# Altium project RTL8316_8208_stand.PrjPcb
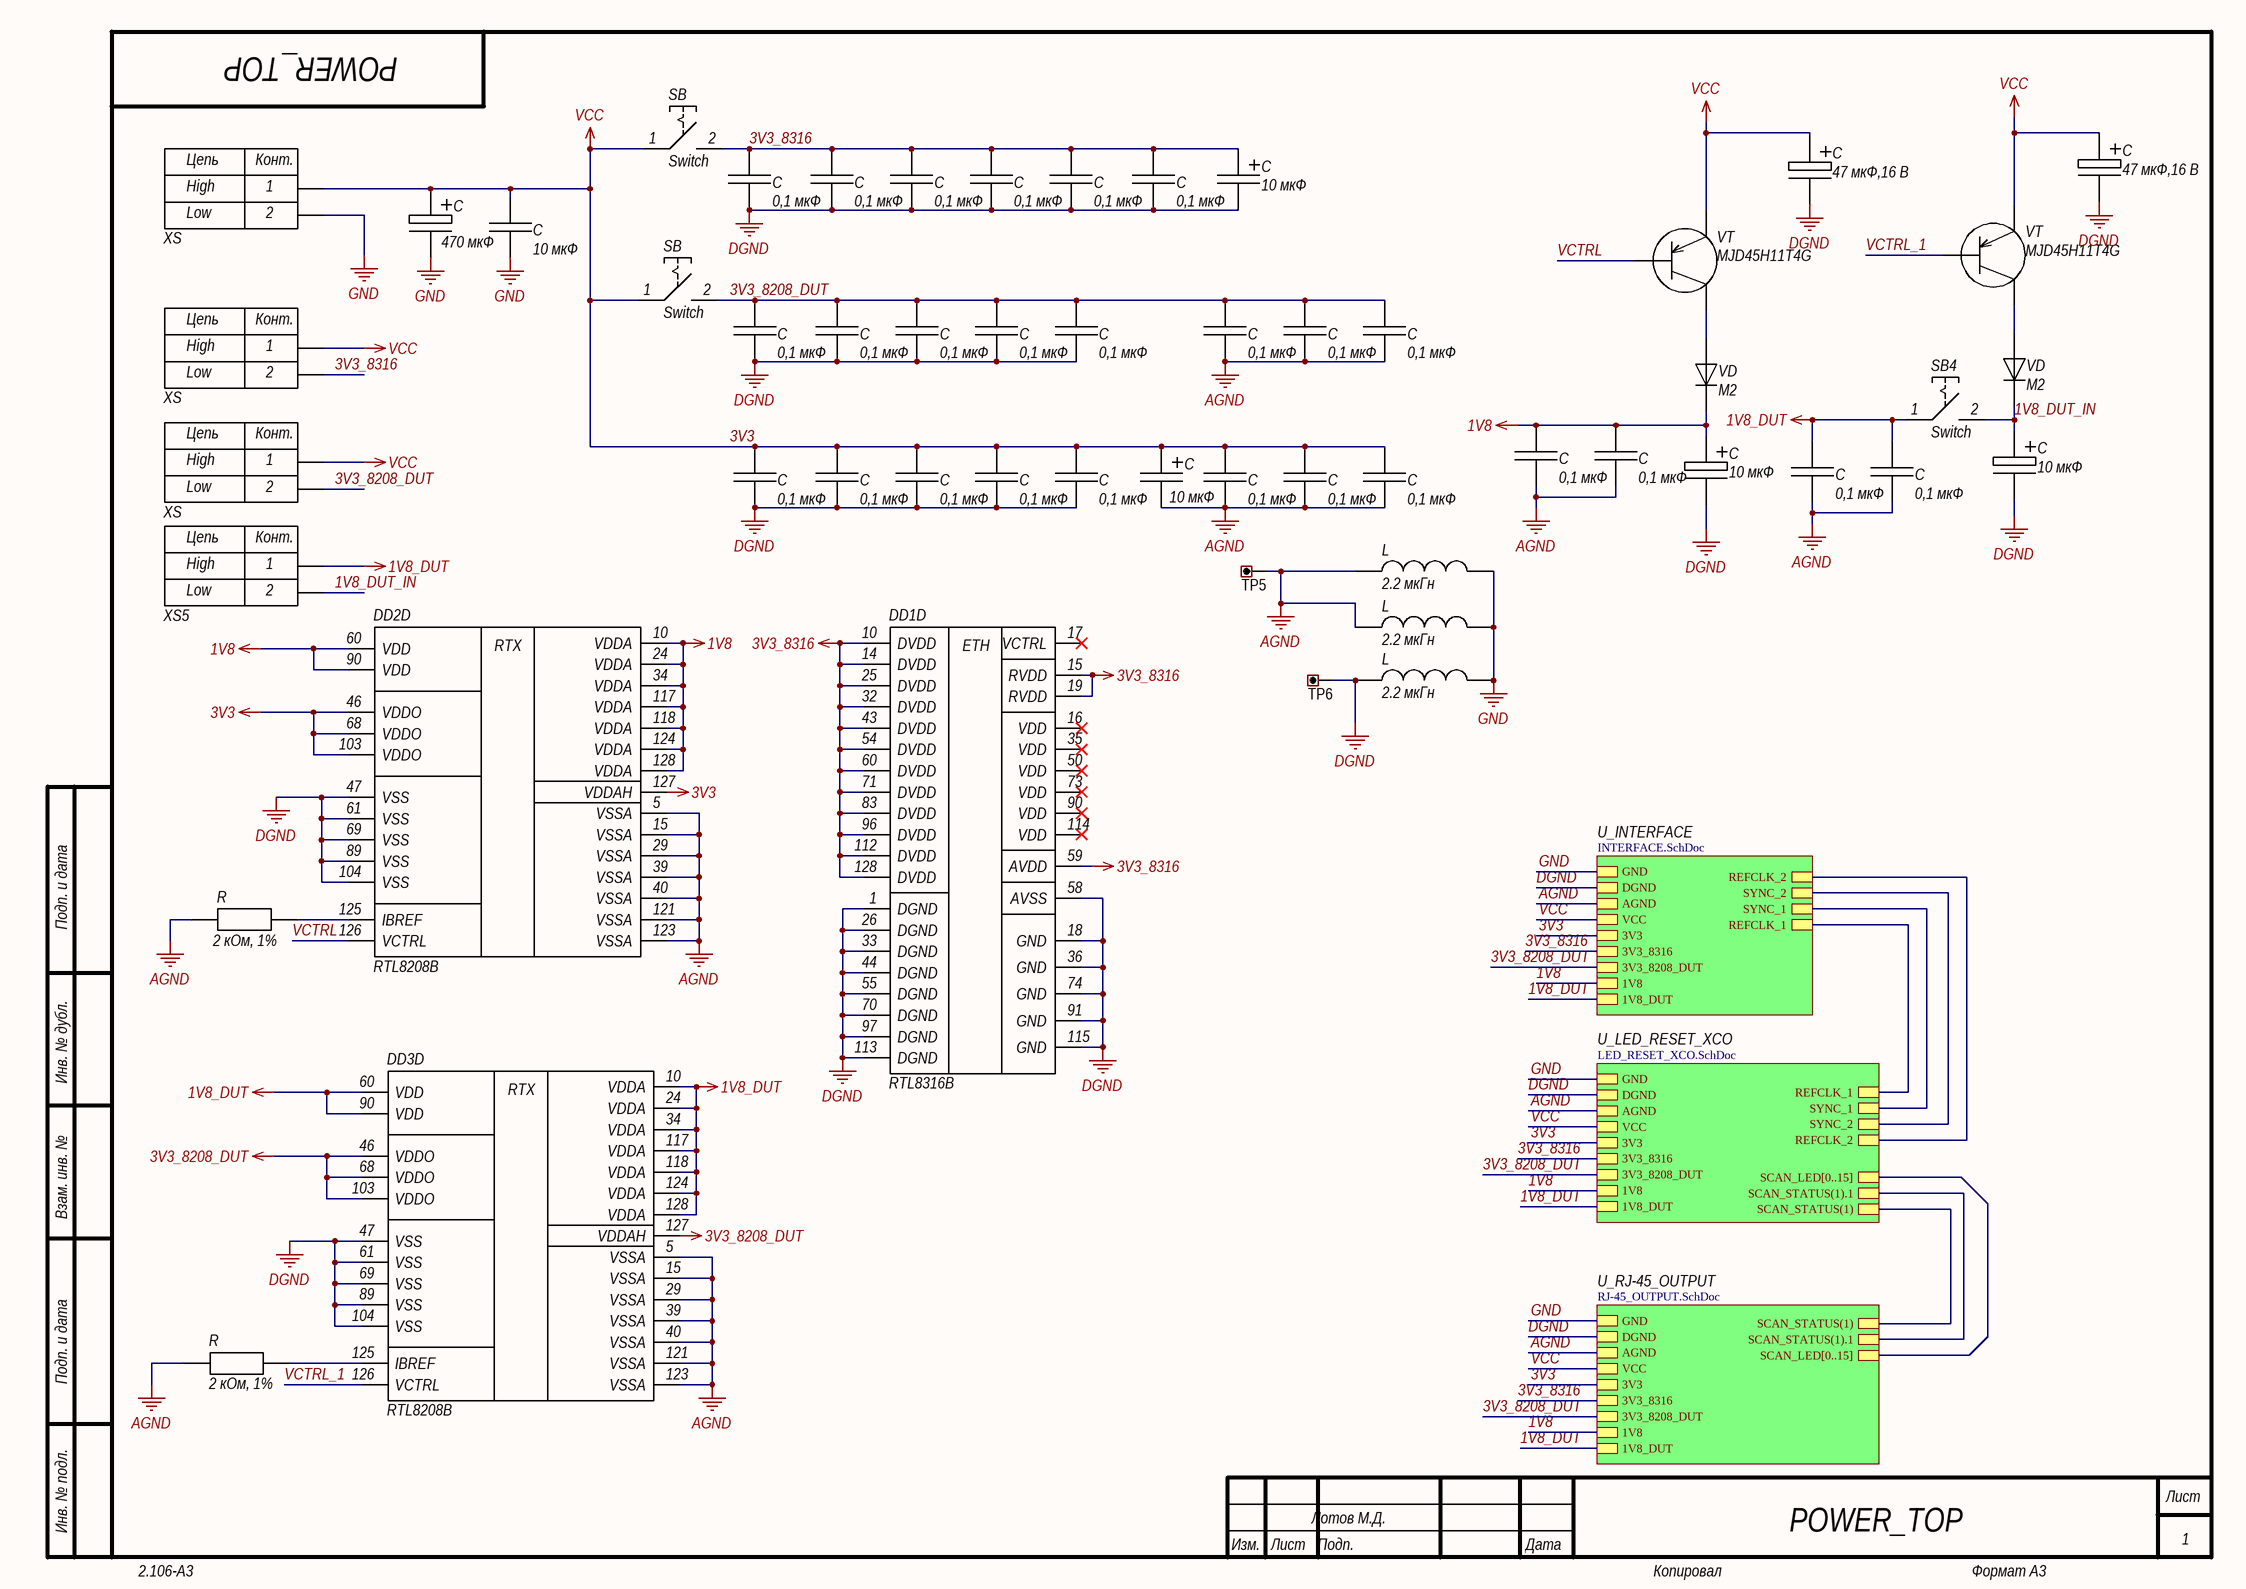
[diagram p0: POWER_TOP.SchDoc]
5 sheets, 305 parts. Net scope: hierarchical (ports join the sheet entries above them; power ports are global).
Board file: RTL8316_STAND.PcbDoc
Sheets:
  POWER_TOP.SchDoc
    U_INTERFACE = INTERFACE.SchDoc
    U_LED_RESET_XCO = LED_RESET_XCO.SchDoc
    U_RJ-45_OUTPUT = RJ-45_OUTPUT.SchDoc
      RJ45_1 = RJ-45_CONN.SchDoc
      RJ45_2 = RJ-45_CONN.SchDoc
      RJ45_3 = RJ-45_CONN.SchDoc
      RJ45_4 = RJ-45_CONN.SchDoc
      RJ45_9 = RJ-45_CONN.SchDoc
      RJ45_10 = RJ-45_CONN.SchDoc
      RJ45_11 = RJ-45_CONN.SchDoc
      RJ45_12 = RJ-45_CONN.SchDoc
      RJ45_5 = RJ-45_CONN.SchDoc
      RJ45_6 = RJ-45_CONN.SchDoc
      RJ45_7 = RJ-45_CONN.SchDoc
      RJ45_8 = RJ-45_CONN.SchDoc
      RJ45_13 = RJ-45_CONN.SchDoc
      RJ45_14 = RJ-45_CONN.SchDoc
      RJ45_15 = RJ-45_CONN.SchDoc
      RJ45_16 = RJ-45_CONN.SchDoc

## Sheet POWER_TOP.SchDoc
size 420 x 297 mm; Author: Лотов М.Д.; Address1: Address1; Address2: Address2; Address3: Address3; Address4: Address4; DocumentNumber: POWER_TOP; SheetNumber: 1; SheetTotal: 5; Scale: 1:1; DocumentType: Схема электрическая принципиальная; FirstReferrence: АБВГ.123456.001

### Parts
(Parts that share a designator on the sheet are numbered #1, #2 ... from top to bottom, then left to right.)
C#1  47 мкФ,16 В  [C_alumin_D=6.3mm]
C#2  47 мкФ,16 В  [C_alumin_D=6.3mm]
C#3  0,1 мкФ  [C0603]
C#4  0,1 мкФ  [C0603]
C#5  0,1 мкФ  [C0603]
C#6  0,1 мкФ  [C0603]
C#7  0,1 мкФ  [C0603]
C#8  0,1 мкФ  [C0603]
C#9  10 мкФ  [TECAP_type C]
C#10  470 мкФ  [C_alumin_8x10mm]
C#11  10 мкФ  [C0805]
C#12  0,1 мкФ  [C0603]
C#13  0,1 мкФ  [C0603]
C#14  0,1 мкФ  [C0603]
C#15  0,1 мкФ  [C0603]
C#16  0,1 мкФ  [C0603]
C#17  0,1 мкФ  [C0603]
C#18  0,1 мкФ  [C0603]
C#19  0,1 мкФ  [C0603]
C#20  0,1 мкФ  [C0603]
C#21  0,1 мкФ  [C0603]
C#22  10 мкФ  [C_alumin_D=4mm]
C#23  10 мкФ  [C_alumin_D=4mm]
C#24  0,1 мкФ  [C0603]
C#25  0,1 мкФ  [C0603]
C#26  0,1 мкФ  [C0603]
C#27  0,1 мкФ  [C0603]
C#28  0,1 мкФ  [C0603]
C#29  10 мкФ  [TECAP_type C]
C#30  0,1 мкФ  [C0603]
C#31  0,1 мкФ  [C0603]
C#32  0,1 мкФ  [C0603]
C#33  0,1 мкФ  [C0603]
C#34  0,1 мкФ  [C0603]
DD1  RTL8316B  [QFP-128_(14x20mm)_0.5mm_ZIF]  (part D of 4)
DD2  RTL8208B  [QFP-128_14x20mm_0.5mm]  (part D of 4)
DD3  RTL8208B  [QFP-128_(14x20mm)_0.5mm_ZIF]  (part D of 4)
L#1  2.2 мкГн  [CD43_Inductor]
L#2  2.2 мкГн  [CD43_Inductor]
L#3  2.2 мкГн  [CD43_Inductor]
R#1  2 кОм, 1%  [R0603]
R#2  2 кОм, 1%  [R0603]
SB4  Switch  [Switch_rocker]
SB#1  Switch  [Switch_rocker]
SB#2  Switch  [Switch_rocker]
TP5  (no value)  [PLS-1]
TP6  (no value)  [PLS-1]
VD#1  M2  [DO-214AC]
VD#2  M2  [DO-214AC]
VT#1  MJD45H11T4G  [DPAK]
VT#2  MJD45H11T4G  [DPAK]
XS5  Banana  [Banana_Connect]  (value not drawn)
XS#1  Banana  [Banana_Connect]  (value not drawn)
XS#2  Banana  [Banana_Connect]  (value not drawn)
XS#3  Banana  [Banana_Connect]  (value not drawn)

### Sub-sheets
U_INTERFACE = INTERFACE.SchDoc: GND, DGND, AGND, VCC, 3V3, 3V3_8316, 3V3_8208_DUT, 1V8, 1V8_DUT, REFCLK_2, SYNC_2, SYNC_1, REFCLK_1
U_LED_RESET_XCO = LED_RESET_XCO.SchDoc: GND, DGND, AGND, VCC, 3V3, 3V3_8316, 3V3_8208_DUT, 1V8, 1V8_DUT, REFCLK_1, REFCLK_2, SYNC_1, SYNC_2, SCAN_LED[0..15], SCAN_STATUS(1).1, SCAN_STATUS(1)
U_RJ-45_OUTPUT = RJ-45_OUTPUT.SchDoc: GND, DGND, AGND, VCC, 3V3, 3V3_8316, 3V3_8208_DUT, 1V8, 1V8_DUT, SCAN_STATUS(1), SCAN_STATUS(1).1, SCAN_LED[0..15]

### Nets
1V8: C#20.1 C#21.1 C#23.1 DD2.10(VDDA) DD2.24(VDDA) DD2.34(VDDA) DD2.60(VDD) DD2.90(VDD) DD2.117(VDDA) DD2.118(VDDA) DD2.124(VDDA) DD2.128(VDDA) VD#1.1 ; sheet U_INTERFACE/1V8, sheet U_LED_RESET_XCO/1V8, sheet U_RJ-45_OUTPUT/1V8
1V8_DUT: C#33.1 C#34.1 DD3.10(VDDA) DD3.24(VDDA) DD3.34(VDDA) DD3.60(VDD) DD3.90(VDD) DD3.117(VDDA) DD3.118(VDDA) DD3.124(VDDA) DD3.128(VDDA) SB4.1 XS5.1 ; sheet U_INTERFACE/1V8_DUT, sheet U_LED_RESET_XCO/1V8_DUT, sheet U_RJ-45_OUTPUT/1V8_DUT
3V3: C#1.1 C#2.1 C#10.1 C#11.1 C#24.1 C#25.1 C#26.1 C#27.1 C#28.1 C#29.1 C#30.1 C#31.1 C#32.1 DD2.46(VDDO) DD2.68(VDDO) DD2.103(VDDO) DD2.127(VDDAH) SB#1.1 SB#2.1 VT#1.2 VT#2.2 XS#1.1 XS#2.1 XS#3.1 ; sheet U_INTERFACE/VCC, sheet U_INTERFACE/3V3, sheet U_LED_RESET_XCO/VCC, sheet U_LED_RESET_XCO/3V3, sheet U_RJ-45_OUTPUT/VCC, sheet U_RJ-45_OUTPUT/3V3  [also labelled VCC]
3V3_8208_DUT: C#12.1 C#13.1 C#14.1 C#15.1 C#16.1 C#17.1 C#18.1 C#19.1 DD3.46(VDDO) DD3.68(VDDO) DD3.103(VDDO) DD3.127(VDDAH) SB#2.2 XS#3.2 ; sheet U_INTERFACE/3V3_8208_DUT, sheet U_LED_RESET_XCO/3V3_8208_DUT, sheet U_RJ-45_OUTPUT/3V3_8208_DUT
3V3_8316: C#3.1 C#4.1 C#5.1 C#6.1 C#7.1 C#8.1 C#9.1 DD1.10(DVDD) DD1.14(DVDD) DD1.15(RVDD) DD1.19(RVDD) DD1.25(DVDD) DD1.32(DVDD) DD1.43(DVDD) DD1.54(DVDD) DD1.59(AVDD) DD1.60(DVDD) DD1.71(DVDD) DD1.83(DVDD) DD1.96(DVDD) DD1.112(DVDD) DD1.128(DVDD) SB#1.2 XS#2.2 ; sheet U_INTERFACE/3V3_8316, sheet U_LED_RESET_XCO/3V3_8316, sheet U_RJ-45_OUTPUT/3V3_8316
AGND: C#17.2 C#18.2 C#19.2 C#20.2 C#21.2 C#29.2 C#30.2 C#31.2 C#32.2 C#33.2 C#34.2 DD2.5(VSSA) DD2.15(VSSA) DD2.29(VSSA) DD2.39(VSSA) DD2.40(VSSA) DD2.121(VSSA) DD2.123(VSSA) DD3.5(VSSA) DD3.15(VSSA) DD3.29(VSSA) DD3.39(VSSA) DD3.40(VSSA) DD3.121(VSSA) DD3.123(VSSA) L#1.1(x) L#2.1(x) R#1.1(x) R#2.1(x) TP5.1 ; sheet U_INTERFACE/AGND, sheet U_LED_RESET_XCO/AGND, sheet U_RJ-45_OUTPUT/AGND
DGND: C#1.2 C#2.2 C#3.2 C#4.2 C#5.2 C#6.2 C#7.2 C#8.2 C#9.2 C#12.2 C#13.2 C#14.2 C#15.2 C#16.2 C#22.2 C#23.2 C#24.2 C#25.2 C#26.2 C#27.2 C#28.2 DD1.1(DGND) DD1.18(GND) DD1.26(DGND) DD1.33(DGND) DD1.36(GND) DD1.44(DGND) DD1.55(DGND) DD1.58(AVSS) DD1.70(DGND) DD1.74(GND) DD1.91(GND) DD1.97(DGND) DD1.113(DGND) DD1.115(GND) DD2.47(VSS) DD2.61(VSS) DD2.69(VSS) DD2.89(VSS) DD2.104(VSS) DD3.47(VSS) DD3.61(VSS) DD3.69(VSS) DD3.89(VSS) DD3.104(VSS) L#3.2 TP6.1 ; sheet U_INTERFACE/DGND, sheet U_LED_RESET_XCO/DGND, sheet U_RJ-45_OUTPUT/DGND
GND: C#10.2 C#11.2 L#1.2 L#2.2 L#3.1(x) XS#1.2 ; sheet U_INTERFACE/GND, sheet U_LED_RESET_XCO/GND, sheet U_RJ-45_OUTPUT/GND
1V8_DUT_IN: C#22.1 SB4.2 VD#2.1 XS5.2
REFCLK_1: sheet U_INTERFACE/REFCLK_1, sheet U_LED_RESET_XCO/REFCLK_1
REFCLK_2: sheet U_INTERFACE/REFCLK_2, sheet U_LED_RESET_XCO/REFCLK_2
SC_ST(1): sheet U_LED_RESET_XCO/SCAN_STATUS(1), sheet U_RJ-45_OUTPUT/SCAN_STATUS(1)
SC_ST(1).1: sheet U_LED_RESET_XCO/SCAN_STATUS(1).1, sheet U_RJ-45_OUTPUT/SCAN_STATUS(1).1
SYNC_1: sheet U_INTERFACE/SYNC_1, sheet U_LED_RESET_XCO/SYNC_1
SYNC_2: sheet U_INTERFACE/SYNC_2, sheet U_LED_RESET_XCO/SYNC_2
VCTRL: DD2.126(VCTRL) VT#2.1
VCTRL_1: DD3.126(VCTRL) VT#1.1
NetDD2_125: DD2.125(IBREF) R#1.2
NetDD3_125: DD3.125(IBREF) R#2.2
NetVD#1_2: VD#1.2 VT#2.3
NetVD#2_2: VD#2.2 VT#1.3

Not connected (* = marked no-connect by the designer): DD1 16(VDD)* 17(VCTRL)* 35(VDD)* 50(VDD)* 73(VDD)* 90(VDD)* 114(VDD)*

### Buses and harness runs
bus sheet U_LED_RESET_XCO/SCAN_LED[0..15] = sheet U_RJ-45_OUTPUT/SCAN_LED[0..15]

### Notes on the sheet
- Подп. и дата
- Инв. № дубл.
- Взам. инв. №
- Инв. № подл.
- Изм.
- Лист
- Подп.
- Дата
- 2.106-A3
- Копировал
- Формат А3
- (in symbol Banana) Цепь; Конт.; High; Low
- (in symbol RTL8208B, part D) RTX
- (in symbol RTL8316B, part D) ETH

### Library data of the parts
C#1 C#2 C#10 C#22 C#23 = Cap_Electrolyte
C#3-C#8 C#11-C#21 C#24-C#28 C#30-C#34 = Capacitance_SMD
C#9 C#29 = T_Cap_SMD
L#1-L#3 = Inductance_SMD
R#1 R#2 = Resistor_SMD
SB4 SB#1 SB#2 = Switch Rocker: ON-OFF SPST Switch
TP5 TP6 = Connector_Test_Point: Manufacturer: Keystone; ValueManufacturerPartNumber: Test point, Keystone, 5001; PartNumber: 5001; TypeConnector: Test point; HelpURL: https://www.digikey.com/product-detail/en/keystone-electronics/5001/36-5001-ND/255327
VD#1 VD#2 = Diode
VT#1 VT#2 = PNP
XS5 XS#1-XS#3 = Banana: Banana Connectors

## Sheet INTERFACE.SchDoc
size 420 x 297 mm; Author: Лотов М.Д,; Address1: Address1; Address2: Address2; Address3: Address3; Address4: Address4; DocumentNumber: INTERFACE; SheetNumber: 2; SheetTotal: 5; Scale: 1:1; DocumentType: Схема электрическая принципиальная; FirstReferrence: АБВГ.123456.001
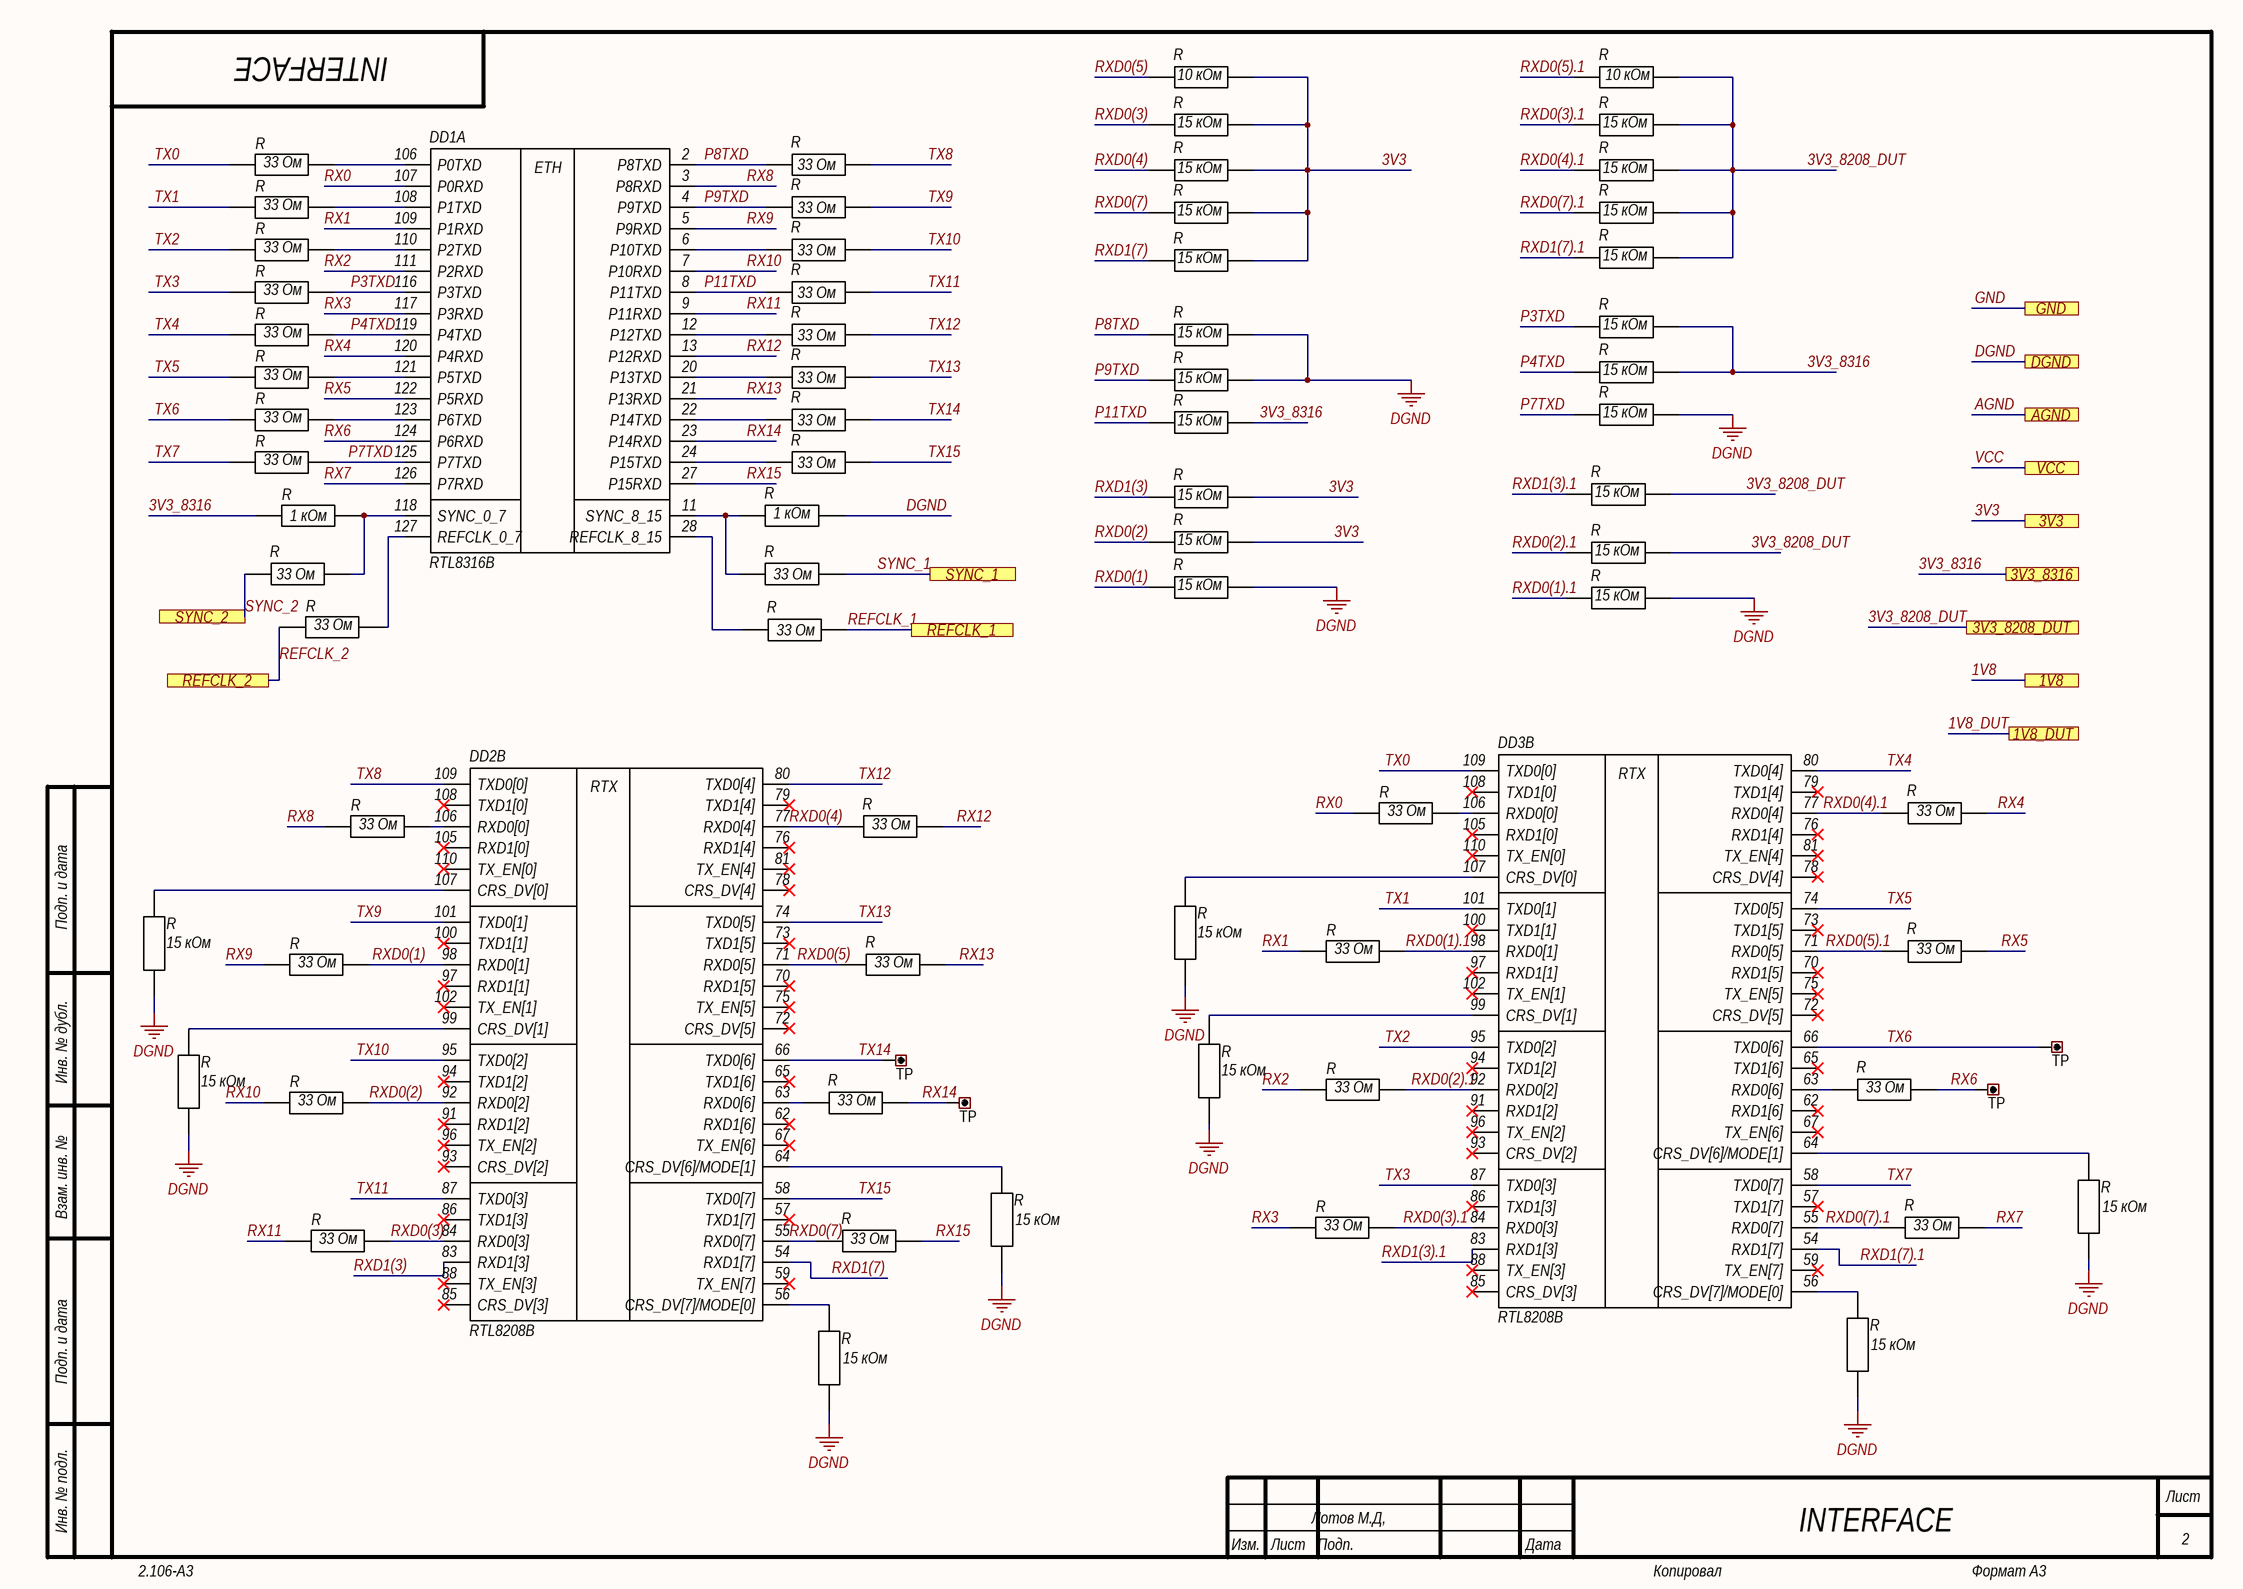
[diagram p1: INTERFACE.SchDoc]

### Parts
(Parts that share a designator on the sheet are numbered #1, #2 ... from top to bottom, then left to right.)
DD1  RTL8316B  [QFP-128_(14x20mm)_0.5mm_ZIF]  (part A of 4)
DD2  RTL8208B  [QFP-128_14x20mm_0.5mm]  (part B of 4)
DD3  RTL8208B  [QFP-128_(14x20mm)_0.5mm_ZIF]  (part B of 4)
R#3  10 кОм  [R0603]
R#4  10 кОм  [R0603]
R#5  15 кОм  [R0603]
R#6  15 кОм  [R0603]
R#7  33 Ом  [R0603]
R#8  33 Ом  [R0603]
R#9  15 кОм  [R0603]
R#10  15 кОм  [R0603]
R#11  33 Ом  [R0603]
R#12  33 Ом  [R0603]
R#13  15 кОм  [R0603]
R#14  15 кОм  [R0603]
R#15  33 Ом  [R0603]
R#16  33 Ом  [R0603]
R#17  15 кОм  [R0603]
R#18  15 кОм  [R0603]
R#19  33 Ом  [R0603]
R#20  33 Ом  [R0603]
R#21  15 кОм  [R0603]
R#22  33 Ом  [R0603]
R#23  33 Ом  [R0603]
R#24  15 кОм  [R0603]
R#25  15 кОм  [R0603]
R#26  33 Ом  [R0603]
R#27  33 Ом  [R0603]
R#28  15 кОм  [R0603]
R#29  15 кОм  [R0603]
R#30  33 Ом  [R0603]
R#31  33 Ом  [R0603]
R#32  15 кОм  [R0603]
R#33  33 Ом  [R0603]
R#34  33 Ом  [R0603]
R#35  15 кОм  [R0603]
R#36  15 кОм  [R0603]
R#37  1 кОм  [R0603]
R#38  1 кОм  [R0603]
R#39  15 кОм  [R0603]
R#40  15 кОм  [R0603]
R#41  33 Ом  [R0603]
R#42  33 Ом  [R0603]
R#43  15 кОм  [R0603]
R#44  15 кОм  [R0603]
R#45  33 Ом  [R0603]
R#46  33 Ом  [R0603]
R#47  33 Ом  [R0603]
R#48  33 Ом  [R0603]
R#49  33 Ом  [R0603]
R#50  33 Ом  [R0603]
R#51  33 Ом  [R0603]
R#52  33 Ом  [R0603]
R#53  33 Ом  [R0603]
R#54  33 Ом  [R0603]
R#55  15 кОм  [R0603]
R#56  15 кОм  [R0603]
R#57  33 Ом  [R0603]
R#58  33 Ом  [R0603]
R#59  33 Ом  [R0603]
R#60  33 Ом  [R0603]
R#61  15 кОм  [R0603]
R#62  15 кОм  [R0603]
R#63  33 Ом  [R0603]
R#64  33 Ом  [R0603]
R#65  33 Ом  [R0603]
R#66  33 Ом  [R0603]
R#67  15 кОм  [R0603]
R#68  15 кОм  [R0603]
R#69  15 кОм  [R0603]
R#70  15 кОм  [R0603]
TP#1  (no value)  [PLS2-1]
TP#2  (no value)  [PLS2-1]
TP#3  (no value)  [PLS2-1]
TP#4  (no value)  [PLS2-1]

### Ports
1V8, 1V8_DUT, 3V3, 3V3_8208_DUT, 3V3_8316, AGND, DGND, GND, REFCLK_1, REFCLK_2, SYNC_1, SYNC_2, VCC

### Nets
3V3: R#3.1(x) R#5.1(x) R#9.1(x) R#13.1(x) R#17.1(x) R#35.1(x) R#39.1(x) ; port VCC, port 3V3  [also labelled VCC]
3V3_8208_DUT: R#4.1(x) R#6.1(x) R#10.1(x) R#14.1(x) R#18.1(x) R#36.1(x) R#40.1(x) ; port 3V3_8208_DUT
3V3_8316: R#21.1(x) R#25.1(x) R#32.1(x) R#37.1(x) ; port 3V3_8316
DGND: R#24.1(x) R#28.1(x) R#29.1(x) R#38.1(x) R#43.1(x) R#44.1(x) R#55.1(x) R#56.1(x) R#61.1(x) R#62.1(x) R#67.1(x) R#68.1(x) R#69.1(x) R#70.1(x) ; port DGND
P3TXD: DD1.116(P3TXD) R#19.2 R#21.2
P4TXD: DD1.119(P4TXD) R#22.2 R#25.2
P7TXD: DD1.125(P7TXD) R#29.2 R#33.2
P8TXD: DD1.2(P8TXD) R#8.2 R#24.2
P9TXD: DD1.4(P9TXD) R#12.2 R#28.2
P11TXD: DD1.8(P11TXD) R#20.2 R#32.2
REFCLK_1: R#46.1(x) ; port REFCLK_1
REFCLK_2: R#45.1(x) ; port REFCLK_2
RX0: DD1.107(P0RXD) R#47.1(x)
RX1: DD1.109(P1RXD) R#51.1(x)
RX2: DD1.111(P2RXD) R#57.1(x)
RX3: DD1.117(P3RXD) R#63.1(x)
RX4: DD1.120(P4RXD) R#48.1(x)
RX5: DD1.122(P5RXD) R#52.1(x)
RX6: DD1.124(P6RXD) R#58.1(x) TP#3.1
RX7: DD1.126(P7RXD) R#64.1(x)
RX8: DD1.3(P8RXD) R#49.1(x)
RX9: DD1.5(P9RXD) R#53.1(x)
RX10: DD1.7(P10RXD) R#59.1(x)
RX11: DD1.9(P11RXD) R#65.1(x)
RX12: DD1.13(P12RXD) R#50.1(x)
RX13: DD1.21(P13RXD) R#54.1(x)
RX14: DD1.23(P14RXD) R#60.1(x) TP#4.1
RX15: DD1.27(P15RXD) R#66.1(x)
RXD0(1): DD2.98(RXD0[1]) R#43.2 R#53.2
RXD0(1).1: DD3.98(RXD0[1]) R#44.2 R#51.2
RXD0(2): DD2.92(RXD0[2]) R#39.2 R#59.2
RXD0(2).1: DD3.92(RXD0[2]) R#40.2 R#57.2
RXD0(3): DD2.84(RXD0[3]) R#5.2 R#65.2
RXD0(3).1: DD3.84(RXD0[3]) R#6.2 R#63.2
RXD0(4): DD2.77(RXD0[4]) R#9.2 R#50.2
RXD0(4).1: DD3.77(RXD0[4]) R#10.2 R#48.2
RXD0(5): DD2.71(RXD0[5]) R#3.2 R#54.2
RXD0(5).1: DD3.71(RXD0[5]) R#4.2 R#52.2
RXD0(7): DD2.55(RXD0[7]) R#13.2 R#66.2
RXD0(7).1: DD3.55(RXD0[7]) R#14.2 R#64.2
RXD1(3): DD2.83(RXD1[3]) R#35.2
RXD1(3).1: DD3.83(RXD1[3]) R#36.2
RXD1(7): DD2.54(RXD1[7]) R#17.2
RXD1(7).1: DD3.54(RXD1[7]) R#18.2
SYNC_1: R#42.1(x) ; port SYNC_1
SYNC_2: R#41.1(x) ; port SYNC_2
TX0: DD3.109(TXD0[0]) R#7.1(x)
TX1: DD3.101(TXD0[1]) R#11.1(x)
TX2: DD3.95(TXD0[2]) R#15.1(x)
TX3: DD3.87(TXD0[3]) R#19.1(x)
TX4: DD3.80(TXD0[4]) R#22.1(x)
TX5: DD3.74(TXD0[5]) R#26.1(x)
TX6: DD3.66(TXD0[6]) R#30.1(x) TP#1.1
TX7: DD3.58(TXD0[7]) R#33.1(x)
TX8: DD2.109(TXD0[0]) R#8.1(x)
TX9: DD2.101(TXD0[1]) R#12.1(x)
TX10: DD2.95(TXD0[2]) R#16.1(x)
TX11: DD2.87(TXD0[3]) R#20.1(x)
TX12: DD2.80(TXD0[4]) R#23.1(x)
TX13: DD2.74(TXD0[5]) R#27.1(x)
TX14: DD2.66(TXD0[6]) R#31.1(x) TP#2.1
TX15: DD2.58(TXD0[7]) R#34.1(x)
NetDD1_6: DD1.6(P10TXD) R#16.2
NetDD1_11: DD1.11(SYNC_8_15) R#38.2 R#42.2
NetDD1_12: DD1.12(P12TXD) R#23.2
NetDD1_20: DD1.20(P13TXD) R#27.2
NetDD1_22: DD1.22(P14TXD) R#31.2
NetDD1_24: DD1.24(P15TXD) R#34.2
NetDD1_28: DD1.28(REFCLK_8_15) R#46.2
NetDD1_106: DD1.106(P0TXD) R#7.2
NetDD1_108: DD1.108(P1TXD) R#11.2
NetDD1_110: DD1.110(P2TXD) R#15.2
NetDD1_118: DD1.118(SYNC_0_7) R#37.2 R#41.2
NetDD1_121: DD1.121(P5TXD) R#26.2
NetDD1_123: DD1.123(P6TXD) R#30.2
NetDD1_127: DD1.127(REFCLK_0_7) R#45.2
NetDD2_56: DD2.56(CRS_DV[7]/MODE[0]) R#70.2
NetDD2_63: DD2.63(RXD0[6]) R#60.2
NetDD2_64: DD2.64(CRS_DV[6]/MODE[1]) R#68.2
NetDD2_99: DD2.99(CRS_DV[1]) R#62.2
NetDD2_106: DD2.106(RXD0[0]) R#49.2
NetDD2_107: DD2.107(CRS_DV[0]) R#56.2
NetDD3_56: DD3.56(CRS_DV[7]/MODE[0]) R#69.2
NetDD3_63: DD3.63(RXD0[6]) R#58.2
NetDD3_64: DD3.64(CRS_DV[6]/MODE[1]) R#67.2
NetDD3_99: DD3.99(CRS_DV[1]) R#61.2
NetDD3_106: DD3.106(RXD0[0]) R#47.2
NetDD3_107: DD3.107(CRS_DV[0]) R#55.2

Not connected (* = marked no-connect by the designer): DD2 57(TXD1[7])* 59(TX_EN[7])* 62(RXD1[6])* 65(TXD1[6])* 67(TX_EN[6])* 70(RXD1[5])* 72(CRS_DV[5])* 73(TXD1[5])* 75(TX_EN[5])* 76(RXD1[4])* 78(CRS_DV[4])* 79(TXD1[4])* 81(TX_EN[4])* 85(CRS_DV[3])* 86(TXD1[3])* 88(TX_EN[3])* 91(RXD1[2])* 93(CRS_DV[2])* 94(TXD1[2])* 96(TX_EN[2])* 97(RXD1[1])* 100(TXD1[1])* 102(TX_EN[1])* 105(RXD1[0])* 108(TXD1[0])* 110(TX_EN[0])*; DD3 57(TXD1[7])* 59(TX_EN[7])* 62(RXD1[6])* 65(TXD1[6])* 67(TX_EN[6])* 70(RXD1[5])* 72(CRS_DV[5])* 73(TXD1[5])* 75(TX_EN[5])* 76(RXD1[4])* 78(CRS_DV[4])* 79(TXD1[4])* 81(TX_EN[4])* 85(CRS_DV[3])* 86(TXD1[3])* 88(TX_EN[3])* 91(RXD1[2])* 93(CRS_DV[2])* 94(TXD1[2])* 96(TX_EN[2])* 97(RXD1[1])* 100(TXD1[1])* 102(TX_EN[1])* 105(RXD1[0])* 108(TXD1[0])* 110(TX_EN[0])*

### Notes on the sheet
- Подп. и дата
- Инв. № дубл.
- Взам. инв. №
- Инв. № подл.
- Изм.
- Лист
- Подп.
- Дата
- 2.106-A3
- Копировал
- Формат А3
- (in symbol RTL8208B, part B) RTX
- (in symbol RTL8316B, part A) ETH

### Library data of the parts
R#3-R#70 = Resistor_SMD
TP#1-TP#4 = Connector_Test_Point: as TP5 on sheet POWER_TOP; HelpURL: https://www.digikey.com/product-detail/en/keystone-electronics/5001/36-5001-ND/255327

## Sheet LED_RESET_XCO.SchDoc
size 420 x 297 mm; Author: Лотов М.Д.; Address1: Address1; Address2: Address2; Address3: Address3; Address4: Address4; DocumentNumber: LED_RESET_XCO; SheetNumber: 5; SheetTotal: 5; Scale: 1:1; DocumentType: Схема электрическая принципиальная; FirstReferrence: АБВГ.123456.001
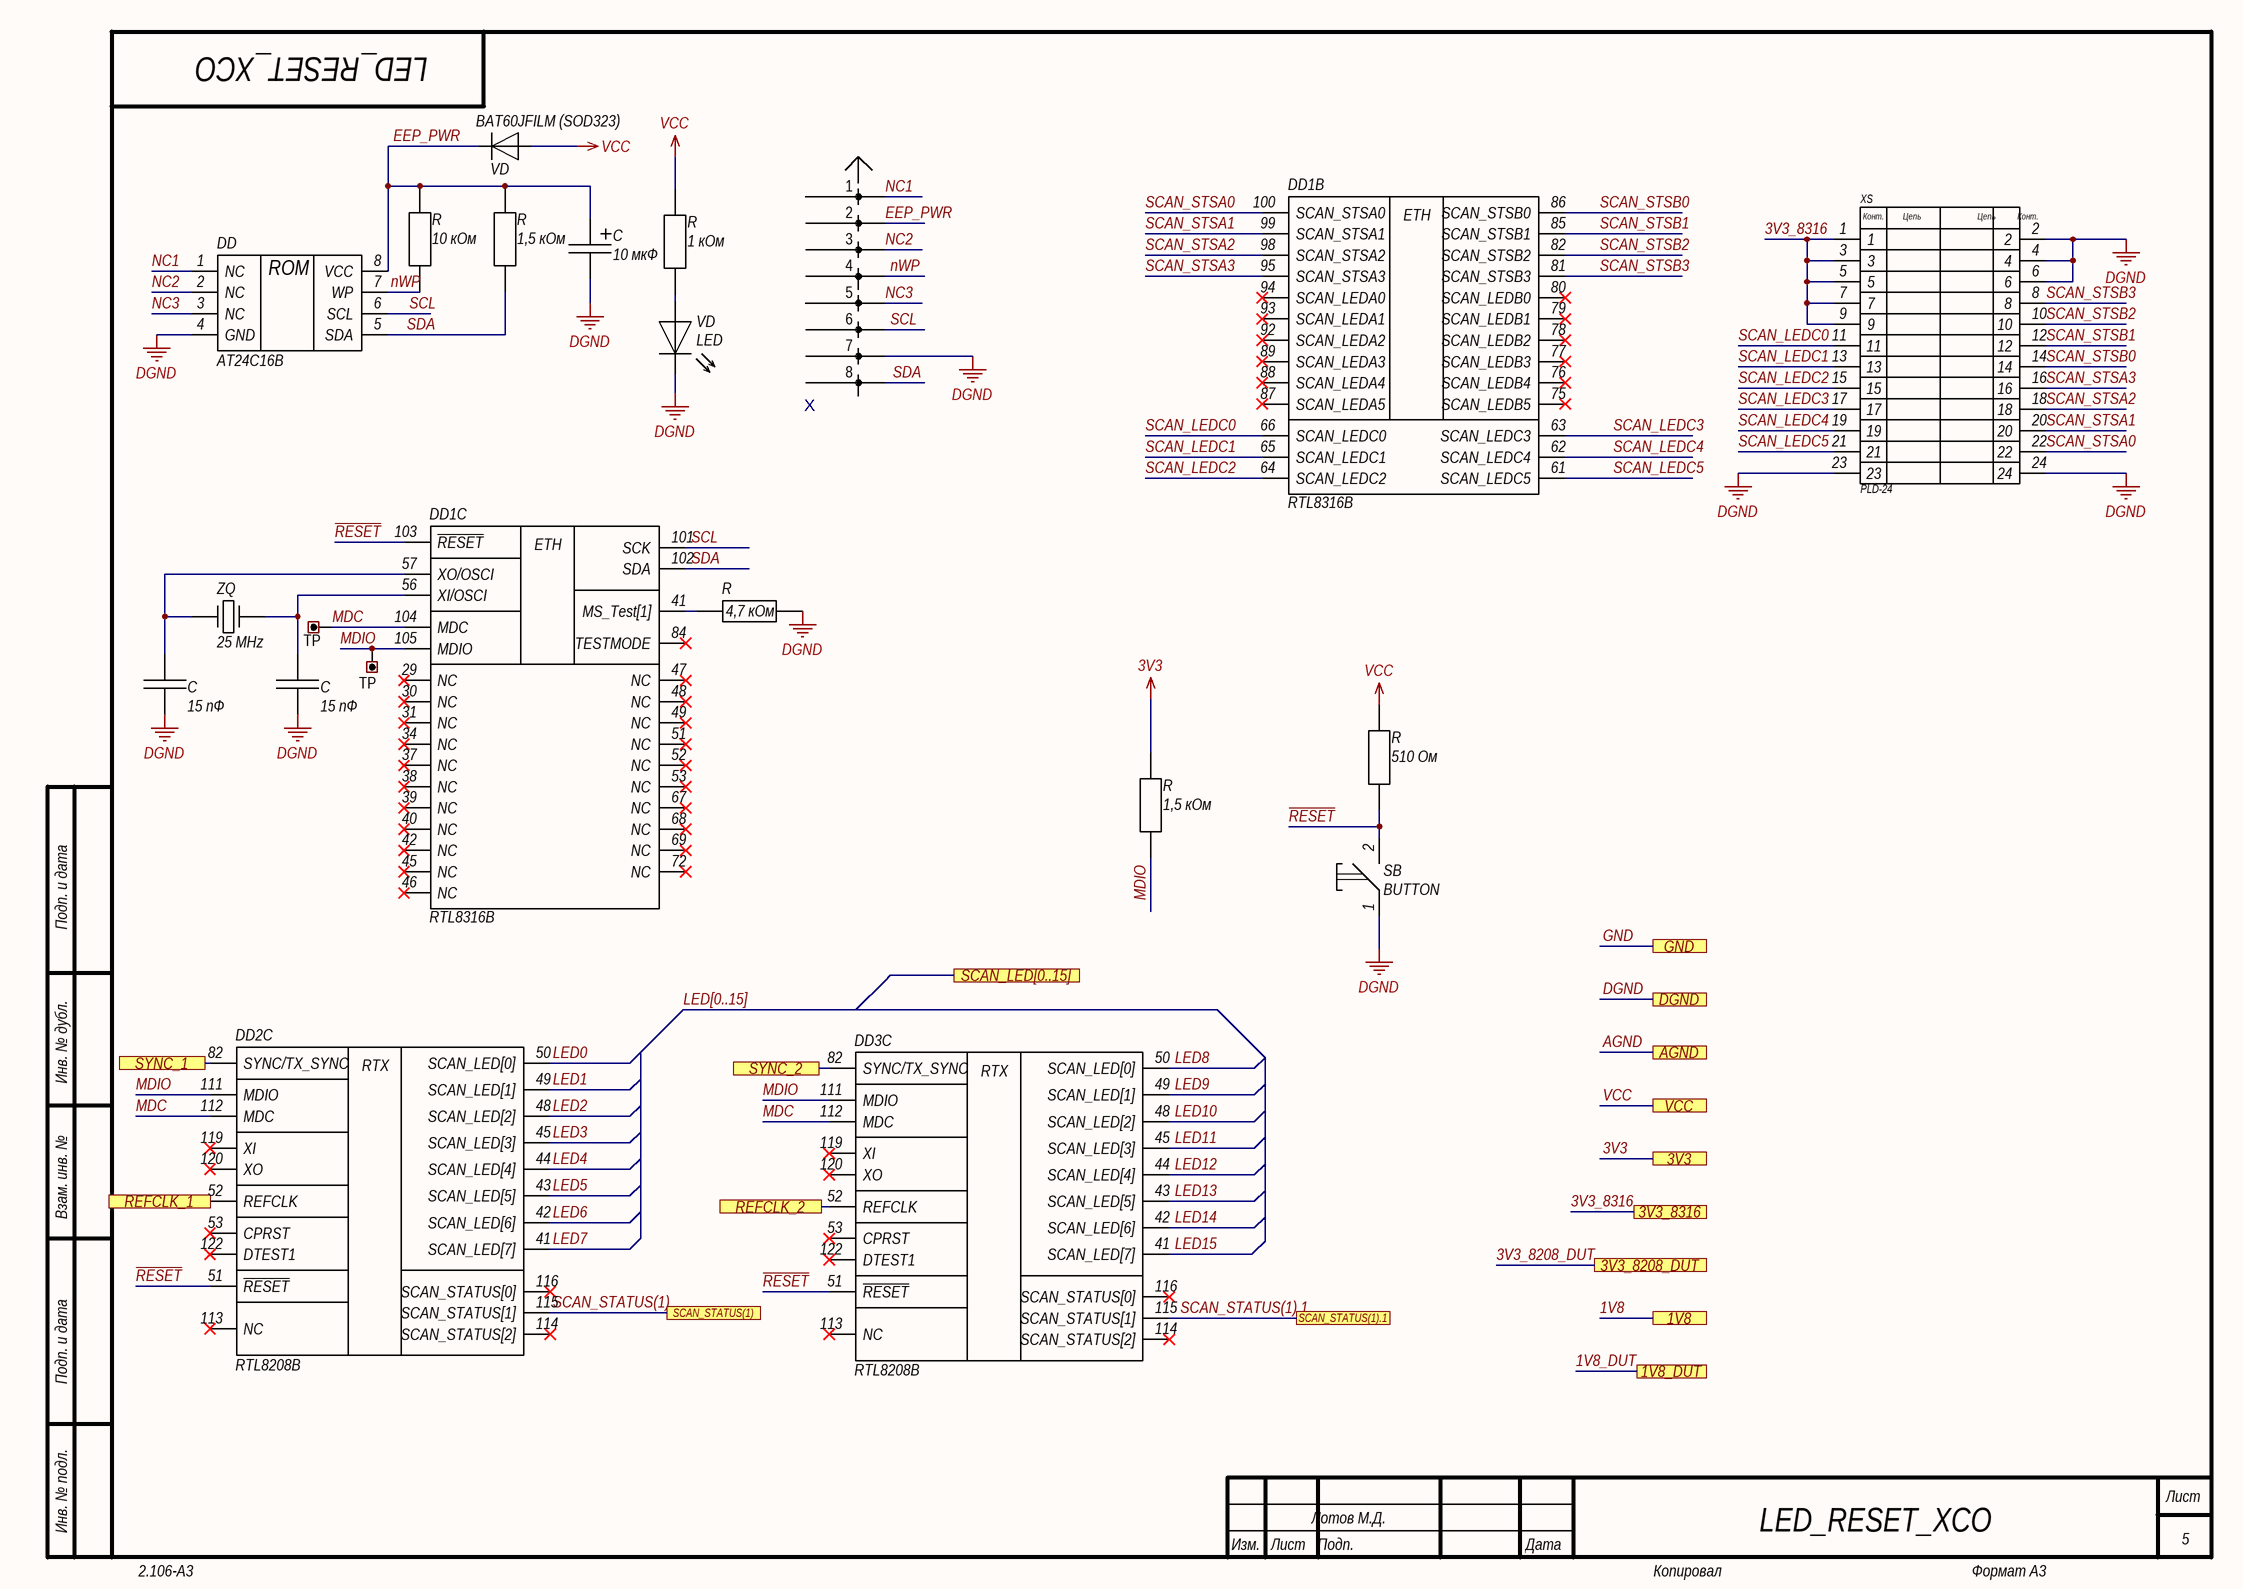
[diagram p2: LED_RESET_XCO.SchDoc]

### Parts
(Parts that share a designator on the sheet are numbered #1, #2 ... from top to bottom, then left to right.)
C#35  10 мкФ  [TECAP_type C]
C#36  15 пФ  [C0603]
C#37  15 пФ  [C0603]
DD  AT24C16B  [SOIC-8]
DD1  RTL8316B  [QFP-128_(14x20mm)_0.5mm_ZIF]  (parts B,C of 4)
DD2  RTL8208B  [QFP-128_14x20mm_0.5mm]  (part C of 4)
DD3  RTL8208B  [QFP-128_(14x20mm)_0.5mm_ZIF]  (part C of 4)
R#71  10 кОм  [R0603]
R#72  1,5 кОм  [R0603]
R#73  1 кОм  [R0603]
R#74  4,7 кОм  [R0603]
R#75  510 Ом  [R0603]
R#76  1,5 кОм  [R0603]
SB#3  BUTTON  [Buttom 2pin]
TP#5  (no value)  [PLS2-1]
TP#6  (no value)  [PLS2-1]
VD#3  BAT60JFILM (SOD323)  [SOD323]
VD#4  LED  [LED_0805]
X  PLD8-2,54  [PLD8-2,54]  (value not drawn)
XS#4  PLD-24  [PLD24_pitch_2.0mm]
ZQ  25 MHz  [XTAL_HC-49SM]

### Ports
1V8, 1V8_DUT, 3V3, 3V3_8208_DUT, 3V3_8316, AGND, DGND, GND, REFCLK_1, REFCLK_2, SCAN_LED[0..15], SCAN_STATUS(1), SCAN_STATUS(1).1, SYNC_1, SYNC_2, VCC

### Nets
3V3: R#73.2 R#75.2 R#76.2 VD#3.1(A) ; port VCC, port 3V3  [also labelled VCC]
3V3_8316: XS#4.1 XS#4.3 XS#4.5 XS#4.7 XS#4.9 ; port 3V3_8316
DGND: C#35.2 C#36.2 C#37.2 DD.4(GND) R#74.2 SB#3.1 VD#4.1 X.7 XS#4.2 XS#4.4 XS#4.6 XS#4.23 XS#4.24 ; port DGND
EEP_PWR: C#35.1 DD.8(VCC) R#71.2 R#72.2 VD#3.2(K) X.2
LED0: DD2.50(SCAN_LED[0])
LED1: DD2.49(SCAN_LED[1])
LED2: DD2.48(SCAN_LED[2])
LED3: DD2.45(SCAN_LED[3])
LED4: DD2.44(SCAN_LED[4])
LED5: DD2.43(SCAN_LED[5])
LED6: DD2.42(SCAN_LED[6])
LED7: DD2.41(SCAN_LED[7])
LED8: DD3.50(SCAN_LED[0])
LED9: DD3.49(SCAN_LED[1])
LED10: DD3.48(SCAN_LED[2])
LED11: DD3.45(SCAN_LED[3])
LED12: DD3.44(SCAN_LED[4])
LED13: DD3.43(SCAN_LED[5])
LED14: DD3.42(SCAN_LED[6])
LED15: DD3.41(SCAN_LED[7])
MDC: DD1.104(MDC) DD2.112(MDC) DD3.112(MDC) TP#5.1
MDIO: DD1.105(MDIO) DD2.111(MDIO) DD3.111(MDIO) R#76.1(x) TP#6.1
NC1: DD.1(NC) X.1
NC2: DD.2(NC) X.3
NC3: DD.3(NC) X.5
nWP: DD.7(WP) R#71.1(x) X.4
~{RESET}: DD1.103(~{RESET}) DD2.51(~{RESET}) DD3.51(~{RESET}) R#75.1(x) SB#3.2
REFCLK_1: DD2.52(REFCLK) ; port REFCLK_1
REFCLK_2: DD3.52(REFCLK) ; port REFCLK_2
SCAN_LEDC0: DD1.66(SCAN_LEDC0) XS#4.11
SCAN_LEDC1: DD1.65(SCAN_LEDC1) XS#4.13
SCAN_LEDC2: DD1.64(SCAN_LEDC2) XS#4.15
SCAN_LEDC3: DD1.63(SCAN_LEDC3) XS#4.17
SCAN_LEDC4: DD1.62(SCAN_LEDC4) XS#4.19
SCAN_LEDC5: DD1.61(SCAN_LEDC5) XS#4.21
SCAN_STATUS(1): DD2.115(SCAN_STATUS[1]) ; port SCAN_STATUS(1)  [project net SC_ST(1)]
SCAN_STATUS(1).1: DD3.115(SCAN_STATUS[1]) ; port SCAN_STATUS(1).1  [project net SC_ST(1).1]
SCAN_STSA0: DD1.100(SCAN_STSA0) XS#4.22
SCAN_STSA1: DD1.99(SCAN_STSA1) XS#4.20
SCAN_STSA2: DD1.98(SCAN_STSA2) XS#4.18
SCAN_STSA3: DD1.95(SCAN_STSA3) XS#4.16
SCAN_STSB0: DD1.86(SCAN_STSB0) XS#4.14
SCAN_STSB1: DD1.85(SCAN_STSB1) XS#4.12
SCAN_STSB2: DD1.82(SCAN_STSB2) XS#4.10
SCAN_STSB3: DD1.81(SCAN_STSB3) XS#4.8
SCL: DD.6(SCL) DD1.101(SCK) X.6
SDA: DD.5(SDA) DD1.102(SDA) R#72.1(x) X.8
SYNC_1: DD2.82(SYNC/TX_SYNC) ; port SYNC_1
SYNC_2: DD3.82(SYNC/TX_SYNC) ; port SYNC_2
NetC#36_1: C#36.1 DD1.57(XO/OSCI) ZQ.2
NetC#37_1: C#37.1 DD1.56(XI/OSCI) ZQ.1
NetDD1_41: DD1.41(MS_Test[1]) R#74.1(x)
NetR#73_1: R#73.1(x) VD#4.2

Not connected (* = marked no-connect by the designer): DD1 29(NC)* 30(NC)* 31(NC)* 34(NC)* 37(NC)* 38(NC)* 39(NC)* 40(NC)* 42(NC)* 45(NC)* 46(NC)* 47(NC)* 48(NC)* 49(NC)* 51(NC)* 52(NC)* 53(NC)* 67(NC)* 68(NC)* 69(NC)* 72(NC)* 75(SCAN_LEDB5)* 76(SCAN_LEDB4)* 77(SCAN_LEDB3)* 78(SCAN_LEDB2)* 79(SCAN_LEDB1)* 80(SCAN_LEDB0)* 84(TESTMODE)* 87(SCAN_LEDA5)* 88(SCAN_LEDA4)* 89(SCAN_LEDA3)* 92(SCAN_LEDA2)* 93(SCAN_LEDA1)* 94(SCAN_LEDA0)*; DD2 53(CPRST)* 113(NC)* 114(SCAN_STATUS[2])* 116(SCAN_STATUS[0])* 119(XI)* 120(XO)* 122(DTEST1)*; DD3 53(CPRST)* 113(NC)* 114(SCAN_STATUS[2])* 116(SCAN_STATUS[0])* 119(XI)* 120(XO)* 122(DTEST1)*

### Buses and harness runs
bus LED[0..15] = port SCAN_LED[0..15]

### Notes on the sheet
- Подп. и дата
- Инв. № дубл.
- Взам. инв. №
- Инв. № подл.
- Изм.
- Лист
- Подп.
- Дата
- 2.106-A3
- Копировал
- Формат А3
- (in symbol AT24C16B) ROM
- (in symbol PLD-24) Конт.; Цепь
- (in symbol RTL8208B, part C) RTX
- (in symbol RTL8316B, part B) ETH
- (in symbol RTL8316B, part C) ETH

### Library data of the parts
C#35 = T_Cap_SMD
C#36 C#37 = Capacitance_SMD
R#71-R#76 = Resistor_SMD
SB#3 = BUTTON: 3x6x2.5 / 4.5x6.5
TP#5 TP#6 = Connector_Test_Point: as TP5 on sheet POWER_TOP; HelpURL: https://www.digikey.com/product-detail/en/keystone-electronics/5001/36-5001-ND/255327
VD#3 = BAT60JFILM (SOD323): ComponentHeigt: 0.75; Leadform: в отверстия; Firme: Kingbright; NN: 24003000; KIND: Светодиод L-1154GD Kingbright; Component Link: *; ClassName: *
X = PLD8-2,54: ComponentHeigt: 5.5; Name: Вилка; Specification: Вилка PLD2-2 *; Typ: PLD2-2; ClassName: *; Component Link: *; ComponentWeigt: *; Firme: *; Leadform: *; NN: *; KIND: *
ZQ = XTAL_HC-49S

## Sheet RJ-45_OUTPUT.SchDoc
size 420 x 297 mm; Author: Лотов М.Д.; Address1: Address1; Address2: Address2; Address3: Address3; Address4: Address4; DocumentNumber: RJ-45_OUTPUT; SheetNumber: 3; SheetTotal: 5; Scale: 1:1; DocumentType: Схема электрическая принципиальная; FirstReferrence: АБВГ.123456.001
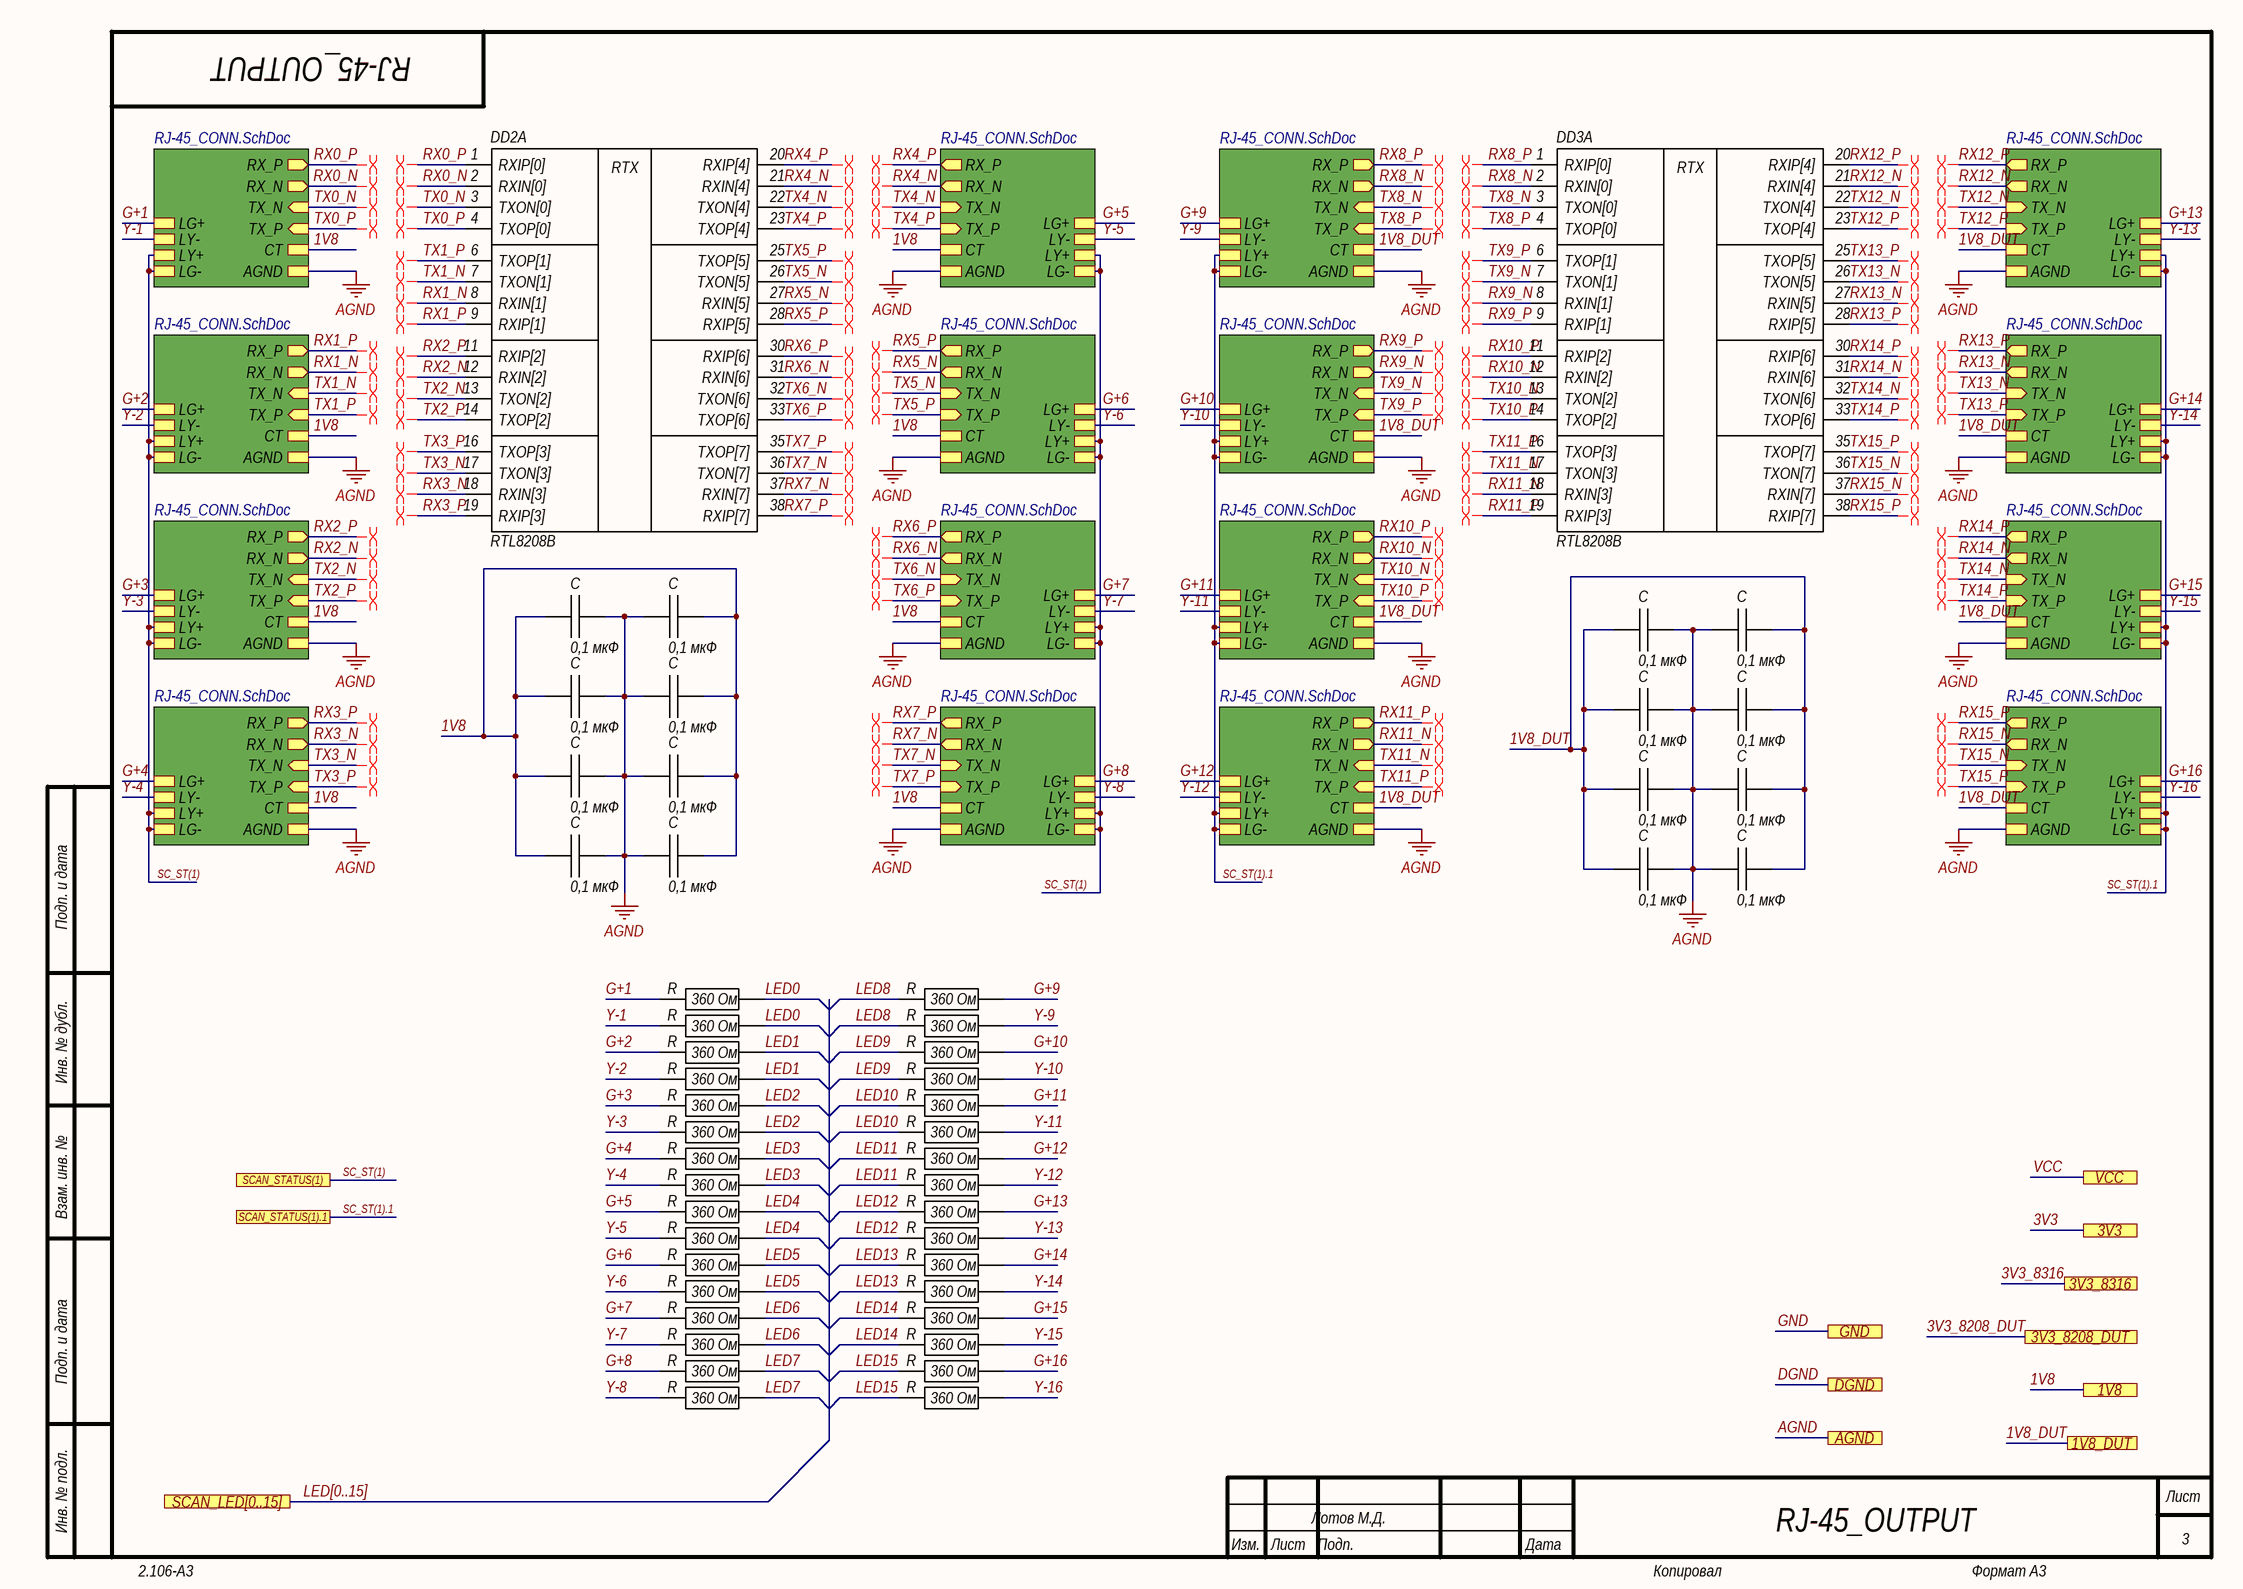
[diagram p3: RJ-45_OUTPUT.SchDoc]

### Parts
(Parts that share a designator on the sheet are numbered #1, #2 ... from top to bottom, then left to right.)
C#38  0,1 мкФ  [C0603]
C#39  0,1 мкФ  [C0603]
C#40  0,1 мкФ  [C0603]
C#41  0,1 мкФ  [C0603]
C#42  0,1 мкФ  [C0603]
C#43  0,1 мкФ  [C0603]
C#44  0,1 мкФ  [C0603]
C#45  0,1 мкФ  [C0603]
C#46  0,1 мкФ  [C0603]
C#47  0,1 мкФ  [C0603]
C#48  0,1 мкФ  [C0603]
C#49  0,1 мкФ  [C0603]
C#50  0,1 мкФ  [C0603]
C#51  0,1 мкФ  [C0603]
C#52  0,1 мкФ  [C0603]
C#53  0,1 мкФ  [C0603]
DD2  RTL8208B  [QFP-128_14x20mm_0.5mm]  (part A of 4)
DD3  RTL8208B  [QFP-128_(14x20mm)_0.5mm_ZIF]  (part A of 4)
R#77  360 Ом  [R0603]
R#78  360 Ом  [R0603]
R#79  360 Ом  [R0603]
R#80  360 Ом  [R0603]
R#81  360 Ом  [R0603]
R#82  360 Ом  [R0603]
R#83  360 Ом  [R0603]
R#84  360 Ом  [R0603]
R#85  360 Ом  [R0603]
R#86  360 Ом  [R0603]
R#87  360 Ом  [R0603]
R#88  360 Ом  [R0603]
R#89  360 Ом  [R0603]
R#90  360 Ом  [R0603]
R#91  360 Ом  [R0603]
R#92  360 Ом  [R0603]
R#93  360 Ом  [R0603]
R#94  360 Ом  [R0603]
R#95  360 Ом  [R0603]
R#96  360 Ом  [R0603]
R#97  360 Ом  [R0603]
R#98  360 Ом  [R0603]
R#99  360 Ом  [R0603]
R#100  360 Ом  [R0603]
R#101  360 Ом  [R0603]
R#102  360 Ом  [R0603]
R#103  360 Ом  [R0603]
R#104  360 Ом  [R0603]
R#105  360 Ом  [R0603]
R#106  360 Ом  [R0603]
R#107  360 Ом  [R0603]
R#108  360 Ом  [R0603]

### Sub-sheets
RJ45_1 = RJ-45_CONN.SchDoc: RX_P (out), CT, AGND, TX_P (in), RX_N (out), TX_N (in), LG+, LY-, LY+, LG-
RJ45_2 = RJ-45_CONN.SchDoc: RX_P (out), CT, AGND, TX_P (in), RX_N (out), TX_N (in), LG+, LY-, LY+, LG-
RJ45_3 = RJ-45_CONN.SchDoc: RX_P (out), CT, AGND, TX_P (in), RX_N (out), TX_N (in), LG+, LY-, LY+, LG-
RJ45_4 = RJ-45_CONN.SchDoc: RX_P (out), CT, AGND, TX_P (in), RX_N (out), TX_N (in), LG+, LY-, LY+, LG-
RJ45_5 = RJ-45_CONN.SchDoc: RX_P (out), CT, AGND, TX_P (in), RX_N (out), TX_N (in), LG+, LY-, LY+, LG-
RJ45_6 = RJ-45_CONN.SchDoc: RX_P (out), CT, AGND, TX_P (in), RX_N (out), TX_N (in), LG+, LY-, LY+, LG-
RJ45_7 = RJ-45_CONN.SchDoc: RX_P (out), CT, AGND, TX_P (in), RX_N (out), TX_N (in), LG+, LY-, LY+, LG-
RJ45_8 = RJ-45_CONN.SchDoc: RX_P (out), CT, AGND, TX_P (in), RX_N (out), TX_N (in), LG+, LY-, LY+, LG-
RJ45_9 = RJ-45_CONN.SchDoc: RX_P (out), CT, AGND, TX_P (in), RX_N (out), TX_N (in), LG+, LY-, LY+, LG-
RJ45_10 = RJ-45_CONN.SchDoc: RX_P (out), CT, AGND, TX_P (in), RX_N (out), TX_N (in), LG+, LY-, LY+, LG-
RJ45_11 = RJ-45_CONN.SchDoc: RX_P (out), CT, AGND, TX_P (in), RX_N (out), TX_N (in), LG+, LY-, LY+, LG-
RJ45_12 = RJ-45_CONN.SchDoc: RX_P (out), CT, AGND, TX_P (in), RX_N (out), TX_N (in), LG+, LY-, LY+, LG-
RJ45_13 = RJ-45_CONN.SchDoc: RX_P (out), CT, AGND, TX_P (in), RX_N (out), TX_N (in), LG+, LY-, LY+, LG-
RJ45_14 = RJ-45_CONN.SchDoc: RX_P (out), CT, AGND, TX_P (in), RX_N (out), TX_N (in), LG+, LY-, LY+, LG-
RJ45_15 = RJ-45_CONN.SchDoc: RX_P (out), CT, AGND, TX_P (in), RX_N (out), TX_N (in), LG+, LY-, LY+, LG-
RJ45_16 = RJ-45_CONN.SchDoc: RX_P (out), CT, AGND, TX_P (in), RX_N (out), TX_N (in), LG+, LY-, LY+, LG-

### Ports
1V8, 1V8_DUT, 3V3, 3V3_8208_DUT, 3V3_8316, AGND, DGND, GND, SCAN_LED[0..15], SCAN_STATUS(1), SCAN_STATUS(1).1, VCC

### Nets
1V8: C#38.1 C#39.1 C#42.1 C#43.1 C#46.1 C#47.1 C#50.1 C#51.1 ; port 1V8, sheet RJ45_1/CT, sheet RJ45_2/CT, sheet RJ45_3/CT, sheet RJ45_4/CT, sheet RJ45_5/CT, sheet RJ45_6/CT, sheet RJ45_7/CT, sheet RJ45_8/CT
1V8_DUT: C#40.1 C#41.1 C#44.1 C#45.1 C#48.1 C#49.1 C#52.1 C#53.1 ; port 1V8_DUT, sheet RJ45_9/CT, sheet RJ45_10/CT, sheet RJ45_11/CT, sheet RJ45_12/CT, sheet RJ45_13/CT, sheet RJ45_14/CT, sheet RJ45_15/CT, sheet RJ45_16/CT
3V3: port VCC, port 3V3  [also labelled VCC]
AGND: C#38.2 C#39.2 C#40.2 C#41.2 C#42.2 C#43.2 C#44.2 C#45.2 C#46.2 C#47.2 C#48.2 C#49.2 C#50.2 C#51.2 C#52.2 C#53.2 ; port AGND, sheet RJ45_1/AGND, sheet RJ45_2/AGND, sheet RJ45_3/AGND, sheet RJ45_4/AGND, sheet RJ45_9/AGND, sheet RJ45_10/AGND, sheet RJ45_11/AGND, sheet RJ45_12/AGND, sheet RJ45_5/AGND, sheet RJ45_6/AGND, sheet RJ45_7/AGND, sheet RJ45_8/AGND, sheet RJ45_13/AGND, sheet RJ45_14/AGND, sheet RJ45_15/AGND, sheet RJ45_16/AGND
G+1: R#77.1(x) ; sheet RJ45_1/LG+
G+2: R#81.1(x) ; sheet RJ45_2/LG+
G+3: R#85.1(x) ; sheet RJ45_3/LG+
G+4: R#89.1(x) ; sheet RJ45_4/LG+
G+5: R#93.1(x) ; sheet RJ45_5/LG+
G+6: R#97.1(x) ; sheet RJ45_6/LG+
G+7: R#101.1(x) ; sheet RJ45_7/LG+
G+8: R#105.1(x) ; sheet RJ45_8/LG+
G+9: R#78.2 ; sheet RJ45_9/LG+
G+10: R#82.2 ; sheet RJ45_10/LG+
G+11: R#86.2 ; sheet RJ45_11/LG+
G+12: R#90.2 ; sheet RJ45_12/LG+
G+13: R#94.2 ; sheet RJ45_13/LG+
G+14: R#98.2 ; sheet RJ45_14/LG+
G+15: R#102.2 ; sheet RJ45_15/LG+
G+16: R#106.2 ; sheet RJ45_16/LG+
LED0: R#77.2 R#79.2
LED1: R#81.2 R#83.2
LED2: R#85.2 R#87.2
LED3: R#89.2 R#91.2
LED4: R#93.2 R#95.2
LED5: R#97.2 R#99.2
LED6: R#101.2 R#103.2
LED7: R#105.2 R#107.2
LED8: R#78.1(x) R#80.1(x)
LED9: R#82.1(x) R#84.1(x)
LED10: R#86.1(x) R#88.1(x)
LED11: R#90.1(x) R#92.1(x)
LED12: R#94.1(x) R#96.1(x)
LED13: R#98.1(x) R#100.1(x)
LED14: R#102.1(x) R#104.1(x)
LED15: R#106.1(x) R#108.1(x)
RX0_N: DD2.2(RXIN[0]) ; sheet RJ45_1/RX_N
RX0_P: DD2.1(RXIP[0]) ; sheet RJ45_1/RX_P
RX1_N: DD2.8(RXIN[1]) ; sheet RJ45_2/RX_N
RX1_P: DD2.9(RXIP[1]) ; sheet RJ45_2/RX_P
RX2_N: DD2.12(RXIN[2]) ; sheet RJ45_3/RX_N
RX2_P: DD2.11(RXIP[2]) ; sheet RJ45_3/RX_P
RX3_N: DD2.18(RXIN[3]) ; sheet RJ45_4/RX_N
RX3_P: DD2.19(RXIP[3]) ; sheet RJ45_4/RX_P
RX4_N: DD2.21(RXIN[4]) ; sheet RJ45_5/RX_N
RX4_P: DD2.20(RXIP[4]) ; sheet RJ45_5/RX_P
RX5_N: DD2.27(RXIN[5]) ; sheet RJ45_6/RX_N
RX5_P: DD2.28(RXIP[5]) ; sheet RJ45_6/RX_P
RX6_N: DD2.31(RXIN[6]) ; sheet RJ45_7/RX_N
RX6_P: DD2.30(RXIP[6]) ; sheet RJ45_7/RX_P
RX7_N: DD2.37(RXIN[7]) ; sheet RJ45_8/RX_N
RX7_P: DD2.38(RXIP[7]) ; sheet RJ45_8/RX_P
RX8_N: DD3.2(RXIN[0]) ; sheet RJ45_9/RX_N
RX8_P: DD3.1(RXIP[0]) ; sheet RJ45_9/RX_P
RX9_N: DD3.8(RXIN[1]) ; sheet RJ45_10/RX_N
RX9_P: DD3.9(RXIP[1]) ; sheet RJ45_10/RX_P
RX10_N: DD3.12(RXIN[2]) ; sheet RJ45_11/RX_N
RX10_P: DD3.11(RXIP[2]) ; sheet RJ45_11/RX_P
RX11_N: DD3.18(RXIN[3]) ; sheet RJ45_12/RX_N
RX11_P: DD3.19(RXIP[3]) ; sheet RJ45_12/RX_P
RX12_N: DD3.21(RXIN[4]) ; sheet RJ45_13/RX_N
RX12_P: DD3.20(RXIP[4]) ; sheet RJ45_13/RX_P
RX13_N: DD3.27(RXIN[5]) ; sheet RJ45_14/RX_N
RX13_P: DD3.28(RXIP[5]) ; sheet RJ45_14/RX_P
RX14_N: DD3.31(RXIN[6]) ; sheet RJ45_15/RX_N
RX14_P: DD3.30(RXIP[6]) ; sheet RJ45_15/RX_P
RX15_N: DD3.37(RXIN[7]) ; sheet RJ45_16/RX_N
RX15_P: DD3.38(RXIP[7]) ; sheet RJ45_16/RX_P
SC_ST(1): port SCAN_STATUS(1), sheet RJ45_1/LY+, sheet RJ45_1/LG-, sheet RJ45_2/LY+, sheet RJ45_2/LG-, sheet RJ45_3/LY+, sheet RJ45_3/LG-, sheet RJ45_4/LY+, sheet RJ45_4/LG-, sheet RJ45_5/LY+, sheet RJ45_5/LG-, sheet RJ45_6/LY+, sheet RJ45_6/LG-, sheet RJ45_7/LY+, sheet RJ45_7/LG-, sheet RJ45_8/LY+, sheet RJ45_8/LG-
SC_ST(1).1: port SCAN_STATUS(1).1, sheet RJ45_9/LY+, sheet RJ45_9/LG-, sheet RJ45_10/LY+, sheet RJ45_10/LG-, sheet RJ45_11/LY+, sheet RJ45_11/LG-, sheet RJ45_12/LY+, sheet RJ45_12/LG-, sheet RJ45_13/LY+, sheet RJ45_13/LG-, sheet RJ45_14/LY+, sheet RJ45_14/LG-, sheet RJ45_15/LY+, sheet RJ45_15/LG-, sheet RJ45_16/LY+, sheet RJ45_16/LG-
TX0_N: DD2.3(TXON[0]) ; sheet RJ45_1/TX_N
TX0_P: DD2.4(TXOP[0]) ; sheet RJ45_1/TX_P
TX1_N: DD2.7(TXON[1]) ; sheet RJ45_2/TX_N
TX1_P: DD2.6(TXOP[1]) ; sheet RJ45_2/TX_P
TX2_N: DD2.13(TXON[2]) ; sheet RJ45_3/TX_N
TX2_P: DD2.14(TXOP[2]) ; sheet RJ45_3/TX_P
TX3_N: DD2.17(TXON[3]) ; sheet RJ45_4/TX_N
TX3_P: DD2.16(TXOP[3]) ; sheet RJ45_4/TX_P
TX4_N: DD2.22(TXON[4]) ; sheet RJ45_5/TX_N
TX4_P: DD2.23(TXOP[4]) ; sheet RJ45_5/TX_P
TX5_N: DD2.26(TXON[5]) ; sheet RJ45_6/TX_N
TX5_P: DD2.25(TXOP[5]) ; sheet RJ45_6/TX_P
TX6_N: DD2.32(TXON[6]) ; sheet RJ45_7/TX_N
TX6_P: DD2.33(TXOP[6]) ; sheet RJ45_7/TX_P
TX7_N: DD2.36(TXON[7]) ; sheet RJ45_8/TX_N
TX7_P: DD2.35(TXOP[7]) ; sheet RJ45_8/TX_P
TX8_N: DD3.3(TXON[0]) ; sheet RJ45_9/TX_N
TX8_P: DD3.4(TXOP[0]) ; sheet RJ45_9/TX_P
TX9_N: DD3.7(TXON[1]) ; sheet RJ45_10/TX_N
TX9_P: DD3.6(TXOP[1]) ; sheet RJ45_10/TX_P
TX10_N: DD3.13(TXON[2]) ; sheet RJ45_11/TX_N
TX10_P: DD3.14(TXOP[2]) ; sheet RJ45_11/TX_P
TX11_N: DD3.17(TXON[3]) ; sheet RJ45_12/TX_N
TX11_P: DD3.16(TXOP[3]) ; sheet RJ45_12/TX_P
TX12_N: DD3.22(TXON[4]) ; sheet RJ45_13/TX_N
TX12_P: DD3.23(TXOP[4]) ; sheet RJ45_13/TX_P
TX13_N: DD3.26(TXON[5]) ; sheet RJ45_14/TX_N
TX13_P: DD3.25(TXOP[5]) ; sheet RJ45_14/TX_P
TX14_N: DD3.32(TXON[6]) ; sheet RJ45_15/TX_N
TX14_P: DD3.33(TXOP[6]) ; sheet RJ45_15/TX_P
TX15_N: DD3.36(TXON[7]) ; sheet RJ45_16/TX_N
TX15_P: DD3.35(TXOP[7]) ; sheet RJ45_16/TX_P
Y-1: R#79.1(x) ; sheet RJ45_1/LY-
Y-2: R#83.1(x) ; sheet RJ45_2/LY-
Y-3: R#87.1(x) ; sheet RJ45_3/LY-
Y-4: R#91.1(x) ; sheet RJ45_4/LY-
Y-5: R#95.1(x) ; sheet RJ45_5/LY-
Y-6: R#99.1(x) ; sheet RJ45_6/LY-
Y-7: R#103.1(x) ; sheet RJ45_7/LY-
Y-8: R#107.1(x) ; sheet RJ45_8/LY-
Y-9: R#80.2 ; sheet RJ45_9/LY-
Y-10: R#84.2 ; sheet RJ45_10/LY-
Y-11: R#88.2 ; sheet RJ45_11/LY-
Y-12: R#92.2 ; sheet RJ45_12/LY-
Y-13: R#96.2 ; sheet RJ45_13/LY-
Y-14: R#100.2 ; sheet RJ45_14/LY-
Y-15: R#104.2 ; sheet RJ45_15/LY-
Y-16: R#108.2 ; sheet RJ45_16/LY-

### Buses and harness runs
bus LED[0..15] = port SCAN_LED[0..15]

### Layout directives
differential pair: RX0_N, RX0_P, RX1_N, RX1_P, RX2_N, RX2_P, RX3_N, RX3_P, RX4_N, RX4_P, RX5_N, RX5_P, RX6_N, RX6_P, RX7_N, RX7_P, RX8_N, RX8_P, RX9_N, RX9_P, RX10_N, RX10_P, RX11_N, RX11_P, RX12_N, RX12_P, RX13_N, RX13_P, RX14_N, RX14_P, RX15_N, RX15_P, TX0_N, TX0_P, TX1_N, TX1_P, TX2_N, TX2_P, TX3_N, TX3_P, TX4_N, TX4_P, TX5_N, TX5_P, TX6_N, TX6_P, TX7_N, TX7_P, TX8_N, TX8_P, TX9_N, TX9_P, TX10_N, TX10_P, TX11_N, TX11_P, TX12_N, TX12_P, TX13_N, TX13_P, TX14_N, TX14_P, TX15_N, TX15_P

### Notes on the sheet
- Подп. и дата
- Инв. № дубл.
- Взам. инв. №
- Инв. № подл.
- Изм.
- Лист
- Подп.
- Дата
- 2.106-A3
- Копировал
- Формат А3
- (in symbol RTL8208B, part A) RTX

### Library data of the parts
C#38-C#53 = Capacitance_SMD
R#77-R#108 = Resistor_SMD

## Sheet RJ-45_CONN.SchDoc
size 420 x 297 mm; Author: Лотов М.Д.; Address1: Address1; Address2: Address2; Address3: Address3; Address4: Address4; DocumentNumber: RJ-45_CONN; SheetNumber: 4; SheetTotal: 5; Scale: 1:1; DocumentType: Схема электрическая принципиальная; FirstReferrence: АБВГ.123456.001
Used 16 times, as channels U_RJ-45_OUTPUT/RJ45_1, U_RJ-45_OUTPUT/RJ45_2, U_RJ-45_OUTPUT/RJ45_3, U_RJ-45_OUTPUT/RJ45_4, U_RJ-45_OUTPUT/RJ45_9, U_RJ-45_OUTPUT/RJ45_10, U_RJ-45_OUTPUT/RJ45_11, U_RJ-45_OUTPUT/RJ45_12, U_RJ-45_OUTPUT/RJ45_5, U_RJ-45_OUTPUT/RJ45_6, U_RJ-45_OUTPUT/RJ45_7, U_RJ-45_OUTPUT/RJ45_8, U_RJ-45_OUTPUT/RJ45_13, U_RJ-45_OUTPUT/RJ45_14, U_RJ-45_OUTPUT/RJ45_15, U_RJ-45_OUTPUT/RJ45_16. Parts and nets are listed once, with the designators drawn on the sheet.
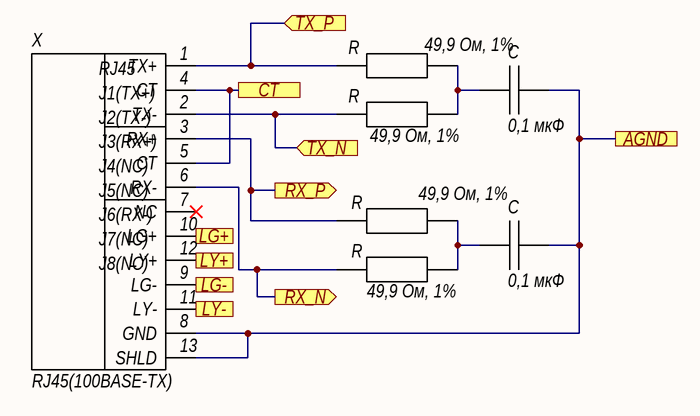
[diagram p4: RJ-45_CONN.SchDoc]

### Parts
(Parts that share a designator on the sheet are numbered #1, #2 ... from top to bottom, then left to right.)
C#1  0,1 мкФ  [C0603]
C#2  0,1 мкФ  [C0603]
R#1  49,9 Ом, 1%  [R0603]
R#2  49,9 Ом, 1%  [R0603]
R#3  49,9 Ом, 1%  [R0603]
R#4  49,9 Ом, 1%  [R0603]
X  RJ45(100BASE-TX)  [RJ-45(LPJ1004AGNL)]

### Ports
AGND, CT, LG+, LG-, LY+, LY-, RX_N (out), RX_P (out), TX_N (in), TX_P (in)

### Nets
AGND: C#1.2 C#2.2 X.8(GND) X.13(SHLD) ; port AGND
CT: X.4(CT) X.5(CT) ; port CT
LG+: X.10(LG+) ; port LG+
LG-: X.9(LG-) ; port LG-
LY+: X.12(LY+) ; port LY+
LY-: X.11(LY-) ; port LY-
RX_N: R#4.1(x) X.6(RX-) ; port RX_N
RX_P: R#3.1(x) X.3(RX+) ; port RX_P
TX_N: R#2.1(x) X.2(TX-) ; port TX_N
TX_P: R#1.1(x) X.1(TX+) ; port TX_P
NetC#1_1: C#1.1 R#1.2 R#2.2
NetC#2_1: C#2.1 R#3.2 R#4.2

Not connected (* = marked no-connect by the designer): X 7(NC)*

### Channels
U_RJ-45_OUTPUT/RJ45_1: designators C=C68 C=C69 R=R137 R=R138 R=R139 R=R140 X=X17; ports AGND=AGND CT=1V8 LG+=G+1 LG-=SC_ST(1) LY+=SC_ST(1) LY-=Y-1 RX_N=RX0_N RX_P=RX0_P TX_N=TX0_N TX_P=TX0_P
U_RJ-45_OUTPUT/RJ45_2: designators C=C66 C=C67 R=R133 R=R134 R=R135 R=R136 X=X16; ports AGND=AGND CT=1V8 LG+=G+2 LG-=SC_ST(1) LY+=SC_ST(1) LY-=Y-2 RX_N=RX1_N RX_P=RX1_P TX_N=TX1_N TX_P=TX1_P
U_RJ-45_OUTPUT/RJ45_3: designators C=C64 C=C65 R=R129 R=R130 R=R131 R=R132 X=X15; ports AGND=AGND CT=1V8 LG+=G+3 LG-=SC_ST(1) LY+=SC_ST(1) LY-=Y-3 RX_N=RX2_N RX_P=RX2_P TX_N=TX2_N TX_P=TX2_P
U_RJ-45_OUTPUT/RJ45_4: designators C=C62 C=C63 R=R125 R=R126 R=R127 R=R128 X=X14; ports AGND=AGND CT=1V8 LG+=G+4 LG-=SC_ST(1) LY+=SC_ST(1) LY-=Y-4 RX_N=RX3_N RX_P=RX3_P TX_N=TX3_N TX_P=TX3_P
U_RJ-45_OUTPUT/RJ45_9: designators C=C60 C=C61 R=R121 R=R122 R=R123 R=R124 X=X13; ports AGND=AGND CT=1V8_DUT LG+=G+9 LG-=SC_ST(1).1 LY+=SC_ST(1).1 LY-=Y-9 RX_N=RX8_N RX_P=RX8_P TX_N=TX8_N TX_P=TX8_P
U_RJ-45_OUTPUT/RJ45_10: designators C=C58 C=C59 R=R117 R=R118 R=R119 R=R120 X=X12; ports AGND=AGND CT=1V8_DUT LG+=G+10 LG-=SC_ST(1).1 LY+=SC_ST(1).1 LY-=Y-10 RX_N=RX9_N RX_P=RX9_P TX_N=TX9_N TX_P=TX9_P
U_RJ-45_OUTPUT/RJ45_11: designators C=C56 C=C57 R=R113 R=R114 R=R115 R=R116 X=X11; ports AGND=AGND CT=1V8_DUT LG+=G+11 LG-=SC_ST(1).1 LY+=SC_ST(1).1 LY-=Y-11 RX_N=RX10_N RX_P=RX10_P TX_N=TX10_N TX_P=TX10_P
U_RJ-45_OUTPUT/RJ45_12: designators C=C54 C=C55 R=R109 R=R110 R=R111 R=R112 X=X10; ports AGND=AGND CT=1V8_DUT LG+=G+12 LG-=SC_ST(1).1 LY+=SC_ST(1).1 LY-=Y-12 RX_N=RX11_N RX_P=RX11_P TX_N=TX11_N TX_P=TX11_P
U_RJ-45_OUTPUT/RJ45_5: designators C=C52 C=C53 R=R105 R=R106 R=R107 R=R108 X=X9; ports AGND=AGND CT=1V8 LG+=G+5 LG-=SC_ST(1) LY+=SC_ST(1) LY-=Y-5 RX_N=RX4_N RX_P=RX4_P TX_N=TX4_N TX_P=TX4_P
U_RJ-45_OUTPUT/RJ45_6: designators C=C50 C=C51 R=R101 R=R102 R=R103 R=R104 X=X8; ports AGND=AGND CT=1V8 LG+=G+6 LG-=SC_ST(1) LY+=SC_ST(1) LY-=Y-6 RX_N=RX5_N RX_P=RX5_P TX_N=TX5_N TX_P=TX5_P
U_RJ-45_OUTPUT/RJ45_7: designators C=C48 C=C49 R=R97 R=R98 R=R99 R=R100 X=X7; ports AGND=AGND CT=1V8 LG+=G+7 LG-=SC_ST(1) LY+=SC_ST(1) LY-=Y-7 RX_N=RX6_N RX_P=RX6_P TX_N=TX6_N TX_P=TX6_P
U_RJ-45_OUTPUT/RJ45_8: designators C=C46 C=C47 R=R93 R=R94 R=R95 R=R96 X=X6; ports AGND=AGND CT=1V8 LG+=G+8 LG-=SC_ST(1) LY+=SC_ST(1) LY-=Y-8 RX_N=RX7_N RX_P=RX7_P TX_N=TX7_N TX_P=TX7_P
U_RJ-45_OUTPUT/RJ45_13: designators C=C44 C=C45 R=R89 R=R90 R=R91 R=R92 X=X5; ports AGND=AGND CT=1V8_DUT LG+=G+13 LG-=SC_ST(1).1 LY+=SC_ST(1).1 LY-=Y-13 RX_N=RX12_N RX_P=RX12_P TX_N=TX12_N TX_P=TX12_P
U_RJ-45_OUTPUT/RJ45_14: designators C=C42 C=C43 R=R85 R=R86 R=R87 R=R88 X=X4; ports AGND=AGND CT=1V8_DUT LG+=G+14 LG-=SC_ST(1).1 LY+=SC_ST(1).1 LY-=Y-14 RX_N=RX13_N RX_P=RX13_P TX_N=TX13_N TX_P=TX13_P
U_RJ-45_OUTPUT/RJ45_15: designators C=C40 C=C41 R=R81 R=R82 R=R83 R=R84 X=X3; ports AGND=AGND CT=1V8_DUT LG+=G+15 LG-=SC_ST(1).1 LY+=SC_ST(1).1 LY-=Y-15 RX_N=RX14_N RX_P=RX14_P TX_N=TX14_N TX_P=TX14_P
U_RJ-45_OUTPUT/RJ45_16: designators C=C38 C=C39 R=R77 R=R78 R=R79 R=R80 X=X2; ports AGND=AGND CT=1V8_DUT LG+=G+16 LG-=SC_ST(1).1 LY+=SC_ST(1).1 LY-=Y-16 RX_N=RX15_N RX_P=RX15_P TX_N=TX15_N TX_P=TX15_P

### Notes on the sheet
- Подп. и дата
- Инв. № дубл.
- Взам. инв. №
- Инв. № подл.
- Изм.
- Лист
- Подп.
- Дата
- 2.106-A3
- Копировал
- Формат А3
- (in symbol RJ-45 FAST Ethernet) RJ45; J1(TX+); J2(TX-); J3(RX+); J4(NC); J5(NC); J6(RX-); J7(NC); J8(NC)

### Library data of the parts
C#1 C#2 = Capacitance_SMD
R#1-R#4 = Resistor_SMD
X = RJ-45 FAST Ethernet

## Nets that join several sheets
1V8: POWER_TOP (13 pins), RJ-45_OUTPUT (8 pins), U_RJ-45_OUTPUT/RJ45_1 (X17.4 X17.5), U_RJ-45_OUTPUT/RJ45_2 (X16.4 X16.5), U_RJ-45_OUTPUT/RJ45_3 (X15.4 X15.5), U_RJ-45_OUTPUT/RJ45_4 (X14.4 X14.5), U_RJ-45_OUTPUT/RJ45_5 (X9.4 X9.5), U_RJ-45_OUTPUT/RJ45_6 (X8.4 X8.5), U_RJ-45_OUTPUT/RJ45_7 (X7.4 X7.5), U_RJ-45_OUTPUT/RJ45_8 (X6.4 X6.5)
1V8_DUT: POWER_TOP (13 pins), RJ-45_OUTPUT (8 pins), U_RJ-45_OUTPUT/RJ45_9 (X13.4 X13.5), U_RJ-45_OUTPUT/RJ45_10 (X12.4 X12.5), U_RJ-45_OUTPUT/RJ45_11 (X11.4 X11.5), U_RJ-45_OUTPUT/RJ45_12 (X10.4 X10.5), U_RJ-45_OUTPUT/RJ45_13 (X5.4 X5.5), U_RJ-45_OUTPUT/RJ45_14 (X4.4 X4.5), U_RJ-45_OUTPUT/RJ45_15 (X3.4 X3.5), U_RJ-45_OUTPUT/RJ45_16 (X2.4 X2.5)
3V3: POWER_TOP (24 pins), INTERFACE (7 pins), LED_RESET_XCO (R#73.2 R#75.2 R#76.2 VD#3.1)
3V3_8208_DUT: POWER_TOP (14 pins), INTERFACE (7 pins)
3V3_8316: POWER_TOP (24 pins), INTERFACE (R#21.1 R#25.1 R#32.1 R#37.1), LED_RESET_XCO (5 pins)
AGND: POWER_TOP (30 pins), RJ-45_OUTPUT (16 pins), U_RJ-45_OUTPUT/RJ45_1 (C68.2 C69.2 X17.8 X17.13), U_RJ-45_OUTPUT/RJ45_2 (C66.2 C67.2 X16.8 X16.13), U_RJ-45_OUTPUT/RJ45_3 (C64.2 C65.2 X15.8 X15.13), U_RJ-45_OUTPUT/RJ45_4 (C62.2 C63.2 X14.8 X14.13), U_RJ-45_OUTPUT/RJ45_9 (C60.2 C61.2 X13.8 X13.13), U_RJ-45_OUTPUT/RJ45_10 (C58.2 C59.2 X12.8 X12.13), U_RJ-45_OUTPUT/RJ45_11 (C56.2 C57.2 X11.8 X11.13), U_RJ-45_OUTPUT/RJ45_12 (C54.2 C55.2 X10.8 X10.13), U_RJ-45_OUTPUT/RJ45_5 (C52.2 C53.2 X9.8 X9.13), U_RJ-45_OUTPUT/RJ45_6 (C50.2 C51.2 X8.8 X8.13), U_RJ-45_OUTPUT/RJ45_7 (C48.2 C49.2 X7.8 X7.13), U_RJ-45_OUTPUT/RJ45_8 (C46.2 C47.2 X6.8 X6.13), U_RJ-45_OUTPUT/RJ45_13 (C44.2 C45.2 X5.8 X5.13), U_RJ-45_OUTPUT/RJ45_14 (C42.2 C43.2 X4.8 X4.13), U_RJ-45_OUTPUT/RJ45_15 (C40.2 C41.2 X3.8 X3.13), U_RJ-45_OUTPUT/RJ45_16 (C38.2 C39.2 X2.8 X2.13)
DGND: POWER_TOP (47 pins), INTERFACE (14 pins), LED_RESET_XCO (13 pins)
G+1: RJ-45_OUTPUT (R#77.1), U_RJ-45_OUTPUT/RJ45_1 (X17.10)
G+2: RJ-45_OUTPUT (R#81.1), U_RJ-45_OUTPUT/RJ45_2 (X16.10)
G+3: RJ-45_OUTPUT (R#85.1), U_RJ-45_OUTPUT/RJ45_3 (X15.10)
G+4: RJ-45_OUTPUT (R#89.1), U_RJ-45_OUTPUT/RJ45_4 (X14.10)
G+5: RJ-45_OUTPUT (R#93.1), U_RJ-45_OUTPUT/RJ45_5 (X9.10)
G+6: RJ-45_OUTPUT (R#97.1), U_RJ-45_OUTPUT/RJ45_6 (X8.10)
G+7: RJ-45_OUTPUT (R#101.1), U_RJ-45_OUTPUT/RJ45_7 (X7.10)
G+8: RJ-45_OUTPUT (R#105.1), U_RJ-45_OUTPUT/RJ45_8 (X6.10)
G+9: RJ-45_OUTPUT (R#78.2), U_RJ-45_OUTPUT/RJ45_9 (X13.10)
G+10: RJ-45_OUTPUT (R#82.2), U_RJ-45_OUTPUT/RJ45_10 (X12.10)
G+11: RJ-45_OUTPUT (R#86.2), U_RJ-45_OUTPUT/RJ45_11 (X11.10)
G+12: RJ-45_OUTPUT (R#90.2), U_RJ-45_OUTPUT/RJ45_12 (X10.10)
G+13: RJ-45_OUTPUT (R#94.2), U_RJ-45_OUTPUT/RJ45_13 (X5.10)
G+14: RJ-45_OUTPUT (R#98.2), U_RJ-45_OUTPUT/RJ45_14 (X4.10)
G+15: RJ-45_OUTPUT (R#102.2), U_RJ-45_OUTPUT/RJ45_15 (X3.10)
G+16: RJ-45_OUTPUT (R#106.2), U_RJ-45_OUTPUT/RJ45_16 (X2.10)
LED0: LED_RESET_XCO (DD2.50), RJ-45_OUTPUT (R#77.2 R#79.2)
LED1: LED_RESET_XCO (DD2.49), RJ-45_OUTPUT (R#81.2 R#83.2)
LED2: LED_RESET_XCO (DD2.48), RJ-45_OUTPUT (R#85.2 R#87.2)
LED3: LED_RESET_XCO (DD2.45), RJ-45_OUTPUT (R#89.2 R#91.2)
LED4: LED_RESET_XCO (DD2.44), RJ-45_OUTPUT (R#93.2 R#95.2)
LED5: LED_RESET_XCO (DD2.43), RJ-45_OUTPUT (R#97.2 R#99.2)
LED6: LED_RESET_XCO (DD2.42), RJ-45_OUTPUT (R#101.2 R#103.2)
LED7: LED_RESET_XCO (DD2.41), RJ-45_OUTPUT (R#105.2 R#107.2)
LED8: LED_RESET_XCO (DD3.50), RJ-45_OUTPUT (R#78.1 R#80.1)
LED9: LED_RESET_XCO (DD3.49), RJ-45_OUTPUT (R#82.1 R#84.1)
LED10: LED_RESET_XCO (DD3.48), RJ-45_OUTPUT (R#86.1 R#88.1)
LED11: LED_RESET_XCO (DD3.45), RJ-45_OUTPUT (R#90.1 R#92.1)
LED12: LED_RESET_XCO (DD3.44), RJ-45_OUTPUT (R#94.1 R#96.1)
LED13: LED_RESET_XCO (DD3.43), RJ-45_OUTPUT (R#98.1 R#100.1)
LED14: LED_RESET_XCO (DD3.42), RJ-45_OUTPUT (R#102.1 R#104.1)
LED15: LED_RESET_XCO (DD3.41), RJ-45_OUTPUT (R#106.1 R#108.1)
REFCLK_1: INTERFACE (R#46.1), LED_RESET_XCO (DD2.52)
REFCLK_2: INTERFACE (R#45.1), LED_RESET_XCO (DD3.52)
RX0_N: RJ-45_OUTPUT (DD2.2), U_RJ-45_OUTPUT/RJ45_1 (R140.1 X17.6)
RX0_P: RJ-45_OUTPUT (DD2.1), U_RJ-45_OUTPUT/RJ45_1 (R139.1 X17.3)
RX1_N: RJ-45_OUTPUT (DD2.8), U_RJ-45_OUTPUT/RJ45_2 (R136.1 X16.6)
RX1_P: RJ-45_OUTPUT (DD2.9), U_RJ-45_OUTPUT/RJ45_2 (R135.1 X16.3)
RX2_N: RJ-45_OUTPUT (DD2.12), U_RJ-45_OUTPUT/RJ45_3 (R132.1 X15.6)
RX2_P: RJ-45_OUTPUT (DD2.11), U_RJ-45_OUTPUT/RJ45_3 (R131.1 X15.3)
RX3_N: RJ-45_OUTPUT (DD2.18), U_RJ-45_OUTPUT/RJ45_4 (R128.1 X14.6)
RX3_P: RJ-45_OUTPUT (DD2.19), U_RJ-45_OUTPUT/RJ45_4 (R127.1 X14.3)
RX4_N: RJ-45_OUTPUT (DD2.21), U_RJ-45_OUTPUT/RJ45_5 (R108.1 X9.6)
RX4_P: RJ-45_OUTPUT (DD2.20), U_RJ-45_OUTPUT/RJ45_5 (R107.1 X9.3)
RX5_N: RJ-45_OUTPUT (DD2.27), U_RJ-45_OUTPUT/RJ45_6 (R104.1 X8.6)
RX5_P: RJ-45_OUTPUT (DD2.28), U_RJ-45_OUTPUT/RJ45_6 (R103.1 X8.3)
RX6_N: RJ-45_OUTPUT (DD2.31), U_RJ-45_OUTPUT/RJ45_7 (R100.1 X7.6)
RX6_P: RJ-45_OUTPUT (DD2.30), U_RJ-45_OUTPUT/RJ45_7 (R99.1 X7.3)
RX7_N: RJ-45_OUTPUT (DD2.37), U_RJ-45_OUTPUT/RJ45_8 (R96.1 X6.6)
RX7_P: RJ-45_OUTPUT (DD2.38), U_RJ-45_OUTPUT/RJ45_8 (R95.1 X6.3)
RX8_N: RJ-45_OUTPUT (DD3.2), U_RJ-45_OUTPUT/RJ45_9 (R124.1 X13.6)
RX8_P: RJ-45_OUTPUT (DD3.1), U_RJ-45_OUTPUT/RJ45_9 (R123.1 X13.3)
RX9_N: RJ-45_OUTPUT (DD3.8), U_RJ-45_OUTPUT/RJ45_10 (R120.1 X12.6)
RX9_P: RJ-45_OUTPUT (DD3.9), U_RJ-45_OUTPUT/RJ45_10 (R119.1 X12.3)
RX10_N: RJ-45_OUTPUT (DD3.12), U_RJ-45_OUTPUT/RJ45_11 (R116.1 X11.6)
RX10_P: RJ-45_OUTPUT (DD3.11), U_RJ-45_OUTPUT/RJ45_11 (R115.1 X11.3)
RX11_N: RJ-45_OUTPUT (DD3.18), U_RJ-45_OUTPUT/RJ45_12 (R112.1 X10.6)
RX11_P: RJ-45_OUTPUT (DD3.19), U_RJ-45_OUTPUT/RJ45_12 (R111.1 X10.3)
RX12_N: RJ-45_OUTPUT (DD3.21), U_RJ-45_OUTPUT/RJ45_13 (R92.1 X5.6)
RX12_P: RJ-45_OUTPUT (DD3.20), U_RJ-45_OUTPUT/RJ45_13 (R91.1 X5.3)
RX13_N: RJ-45_OUTPUT (DD3.27), U_RJ-45_OUTPUT/RJ45_14 (R88.1 X4.6)
RX13_P: RJ-45_OUTPUT (DD3.28), U_RJ-45_OUTPUT/RJ45_14 (R87.1 X4.3)
RX14_N: RJ-45_OUTPUT (DD3.31), U_RJ-45_OUTPUT/RJ45_15 (R84.1 X3.6)
RX14_P: RJ-45_OUTPUT (DD3.30), U_RJ-45_OUTPUT/RJ45_15 (R83.1 X3.3)
RX15_N: RJ-45_OUTPUT (DD3.37), U_RJ-45_OUTPUT/RJ45_16 (R80.1 X2.6)
RX15_P: RJ-45_OUTPUT (DD3.38), U_RJ-45_OUTPUT/RJ45_16 (R79.1 X2.3)
SC_ST(1): LED_RESET_XCO (DD2.115), U_RJ-45_OUTPUT/RJ45_1 (X17.9 X17.12), U_RJ-45_OUTPUT/RJ45_2 (X16.9 X16.12), U_RJ-45_OUTPUT/RJ45_3 (X15.9 X15.12), U_RJ-45_OUTPUT/RJ45_4 (X14.9 X14.12), U_RJ-45_OUTPUT/RJ45_5 (X9.9 X9.12), U_RJ-45_OUTPUT/RJ45_6 (X8.9 X8.12), U_RJ-45_OUTPUT/RJ45_7 (X7.9 X7.12), U_RJ-45_OUTPUT/RJ45_8 (X6.9 X6.12)
SC_ST(1).1: LED_RESET_XCO (DD3.115), U_RJ-45_OUTPUT/RJ45_9 (X13.9 X13.12), U_RJ-45_OUTPUT/RJ45_10 (X12.9 X12.12), U_RJ-45_OUTPUT/RJ45_11 (X11.9 X11.12), U_RJ-45_OUTPUT/RJ45_12 (X10.9 X10.12), U_RJ-45_OUTPUT/RJ45_13 (X5.9 X5.12), U_RJ-45_OUTPUT/RJ45_14 (X4.9 X4.12), U_RJ-45_OUTPUT/RJ45_15 (X3.9 X3.12), U_RJ-45_OUTPUT/RJ45_16 (X2.9 X2.12)
SYNC_1: INTERFACE (R#42.1), LED_RESET_XCO (DD2.82)
SYNC_2: INTERFACE (R#41.1), LED_RESET_XCO (DD3.82)
TX0_N: RJ-45_OUTPUT (DD2.3), U_RJ-45_OUTPUT/RJ45_1 (R138.1 X17.2)
TX0_P: RJ-45_OUTPUT (DD2.4), U_RJ-45_OUTPUT/RJ45_1 (R137.1 X17.1)
TX1_N: RJ-45_OUTPUT (DD2.7), U_RJ-45_OUTPUT/RJ45_2 (R134.1 X16.2)
TX1_P: RJ-45_OUTPUT (DD2.6), U_RJ-45_OUTPUT/RJ45_2 (R133.1 X16.1)
TX2_N: RJ-45_OUTPUT (DD2.13), U_RJ-45_OUTPUT/RJ45_3 (R130.1 X15.2)
TX2_P: RJ-45_OUTPUT (DD2.14), U_RJ-45_OUTPUT/RJ45_3 (R129.1 X15.1)
TX3_N: RJ-45_OUTPUT (DD2.17), U_RJ-45_OUTPUT/RJ45_4 (R126.1 X14.2)
TX3_P: RJ-45_OUTPUT (DD2.16), U_RJ-45_OUTPUT/RJ45_4 (R125.1 X14.1)
TX4_N: RJ-45_OUTPUT (DD2.22), U_RJ-45_OUTPUT/RJ45_5 (R106.1 X9.2)
TX4_P: RJ-45_OUTPUT (DD2.23), U_RJ-45_OUTPUT/RJ45_5 (R105.1 X9.1)
TX5_N: RJ-45_OUTPUT (DD2.26), U_RJ-45_OUTPUT/RJ45_6 (R102.1 X8.2)
TX5_P: RJ-45_OUTPUT (DD2.25), U_RJ-45_OUTPUT/RJ45_6 (R101.1 X8.1)
TX6_N: RJ-45_OUTPUT (DD2.32), U_RJ-45_OUTPUT/RJ45_7 (R98.1 X7.2)
TX6_P: RJ-45_OUTPUT (DD2.33), U_RJ-45_OUTPUT/RJ45_7 (R97.1 X7.1)
TX7_N: RJ-45_OUTPUT (DD2.36), U_RJ-45_OUTPUT/RJ45_8 (R94.1 X6.2)
TX7_P: RJ-45_OUTPUT (DD2.35), U_RJ-45_OUTPUT/RJ45_8 (R93.1 X6.1)
TX8_N: RJ-45_OUTPUT (DD3.3), U_RJ-45_OUTPUT/RJ45_9 (R122.1 X13.2)
TX8_P: RJ-45_OUTPUT (DD3.4), U_RJ-45_OUTPUT/RJ45_9 (R121.1 X13.1)
TX9_N: RJ-45_OUTPUT (DD3.7), U_RJ-45_OUTPUT/RJ45_10 (R118.1 X12.2)
TX9_P: RJ-45_OUTPUT (DD3.6), U_RJ-45_OUTPUT/RJ45_10 (R117.1 X12.1)
TX10_N: RJ-45_OUTPUT (DD3.13), U_RJ-45_OUTPUT/RJ45_11 (R114.1 X11.2)
TX10_P: RJ-45_OUTPUT (DD3.14), U_RJ-45_OUTPUT/RJ45_11 (R113.1 X11.1)
TX11_N: RJ-45_OUTPUT (DD3.17), U_RJ-45_OUTPUT/RJ45_12 (R110.1 X10.2)
TX11_P: RJ-45_OUTPUT (DD3.16), U_RJ-45_OUTPUT/RJ45_12 (R109.1 X10.1)
TX12_N: RJ-45_OUTPUT (DD3.22), U_RJ-45_OUTPUT/RJ45_13 (R90.1 X5.2)
TX12_P: RJ-45_OUTPUT (DD3.23), U_RJ-45_OUTPUT/RJ45_13 (R89.1 X5.1)
TX13_N: RJ-45_OUTPUT (DD3.26), U_RJ-45_OUTPUT/RJ45_14 (R86.1 X4.2)
TX13_P: RJ-45_OUTPUT (DD3.25), U_RJ-45_OUTPUT/RJ45_14 (R85.1 X4.1)
TX14_N: RJ-45_OUTPUT (DD3.32), U_RJ-45_OUTPUT/RJ45_15 (R82.1 X3.2)
TX14_P: RJ-45_OUTPUT (DD3.33), U_RJ-45_OUTPUT/RJ45_15 (R81.1 X3.1)
TX15_N: RJ-45_OUTPUT (DD3.36), U_RJ-45_OUTPUT/RJ45_16 (R78.1 X2.2)
TX15_P: RJ-45_OUTPUT (DD3.35), U_RJ-45_OUTPUT/RJ45_16 (R77.1 X2.1)
Y-1: RJ-45_OUTPUT (R#79.1), U_RJ-45_OUTPUT/RJ45_1 (X17.11)
Y-2: RJ-45_OUTPUT (R#83.1), U_RJ-45_OUTPUT/RJ45_2 (X16.11)
Y-3: RJ-45_OUTPUT (R#87.1), U_RJ-45_OUTPUT/RJ45_3 (X15.11)
Y-4: RJ-45_OUTPUT (R#91.1), U_RJ-45_OUTPUT/RJ45_4 (X14.11)
Y-5: RJ-45_OUTPUT (R#95.1), U_RJ-45_OUTPUT/RJ45_5 (X9.11)
Y-6: RJ-45_OUTPUT (R#99.1), U_RJ-45_OUTPUT/RJ45_6 (X8.11)
Y-7: RJ-45_OUTPUT (R#103.1), U_RJ-45_OUTPUT/RJ45_7 (X7.11)
Y-8: RJ-45_OUTPUT (R#107.1), U_RJ-45_OUTPUT/RJ45_8 (X6.11)
Y-9: RJ-45_OUTPUT (R#80.2), U_RJ-45_OUTPUT/RJ45_9 (X13.11)
Y-10: RJ-45_OUTPUT (R#84.2), U_RJ-45_OUTPUT/RJ45_10 (X12.11)
Y-11: RJ-45_OUTPUT (R#88.2), U_RJ-45_OUTPUT/RJ45_11 (X11.11)
Y-12: RJ-45_OUTPUT (R#92.2), U_RJ-45_OUTPUT/RJ45_12 (X10.11)
Y-13: RJ-45_OUTPUT (R#96.2), U_RJ-45_OUTPUT/RJ45_13 (X5.11)
Y-14: RJ-45_OUTPUT (R#100.2), U_RJ-45_OUTPUT/RJ45_14 (X4.11)
Y-15: RJ-45_OUTPUT (R#104.2), U_RJ-45_OUTPUT/RJ45_15 (X3.11)
Y-16: RJ-45_OUTPUT (R#108.2), U_RJ-45_OUTPUT/RJ45_16 (X2.11)